# Altium project ADV212BBCZ-150.PrjPcb (part 1 of 2)
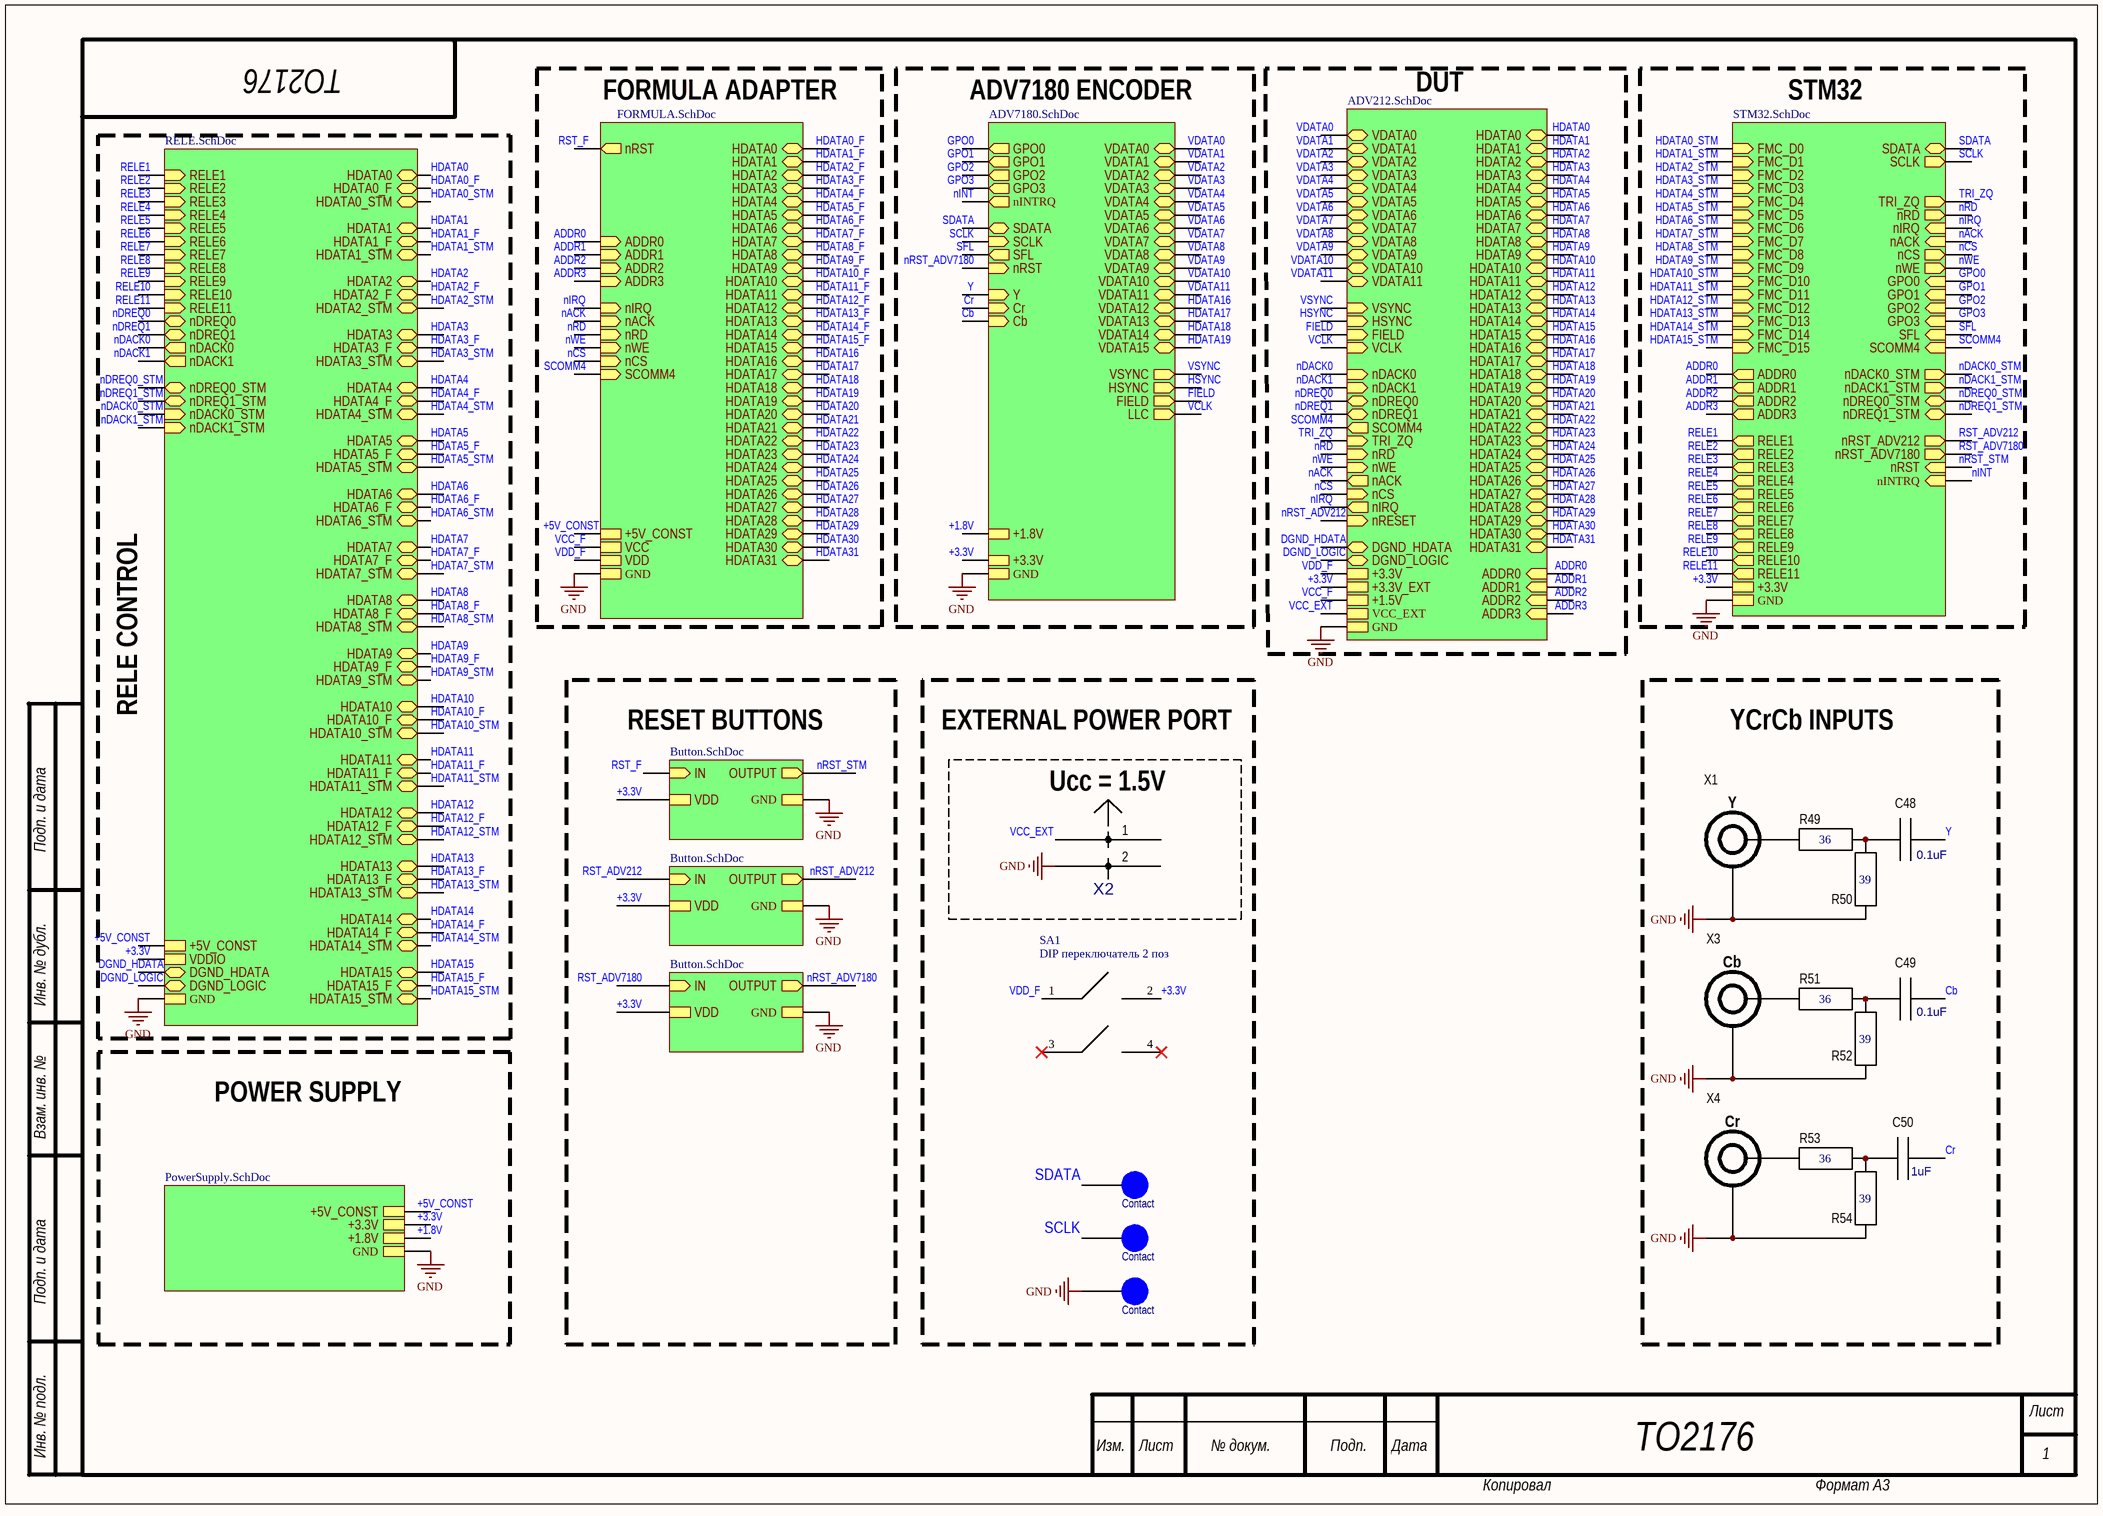
[diagram p0: Main.SchDoc]
8 sheets, 345 parts. Net scope: strictly hierarchical (ports join the sheet entries above them; power ports are local).
Board file: PCB1.PcbDoc
Sheets:
  Main.SchDoc
    ADV212 = ADV212.SchDoc
    STM32 = STM32.SchDoc
    F2K = FORMULA.SchDoc
    ADV7180 = ADV7180.SchDoc
    REL = RELE.SchDoc
    PS = PowerSupply.SchDoc
    BTN1 = Button.SchDoc
    BTN2 = Button.SchDoc
    BTN2 = Button.SchDoc

## Sheet Main.SchDoc
size A3; SheetNumber: 1; SheetTotal: 8

### Parts
C48  0.1uF  [0603]
C49  0.1uF  [0603]
C50  1uF  [0603]
KP1  Contact  [Contact]
KP2  Contact  [Contact]
KP3  Contact  [Contact]
R49  36  [0603]
R50  39  [0603]
R51  36  [0603]
R52  39  [0603]
R53  36  [0603]
R54  39  [0603]
SA1  DIP переключатель 2 поз  [DMHA-02G]
X1  Коннектор "Тюльпан"  [NYS-354]  (value not drawn)
X2  DS1073-01-2x1-MRT6 (2pin)  [DS1073-01-2x1-MRT6 (2 pin)]  (value not drawn)
X3  Коннектор "Тюльпан"  [NYS-354]  (value not drawn)
X4  Коннектор "Тюльпан"  [NYS-354]  (value not drawn)

### Blocks framed on the sheet
EXTERNAL POWER PORT: KP1-KP3 SA1
YCrCb INPUTS: C48-C50 R49-R54 X1 X3 X4
Ucc = 1.5V: X2

### Sub-sheets
ADV212 = ADV212.SchDoc: HDATA7 (bidir), HDATA8 (bidir), HDATA6 (bidir), HDATA5 (bidir), HDATA11 (bidir), HDATA10 (bidir), HDATA3 (bidir), HDATA4 (bidir), HDATA9 (bidir), HDATA12 (bidir), HDATA13 (bidir), HDATA14 (bidir), HDATA15 (bidir), HDATA2 (bidir), HDATA1 (bidir), HDATA0 (bidir), VDATA9 (bidir), VDATA10 (bidir), VDATA8 (bidir), VDATA7 (bidir), VDATA5 (bidir), VDATA6 (bidir), VDATA11 (bidir), VDATA4 (bidir), VDATA3 (bidir), VDATA2 (bidir), ADDR1 (in), ADDR2 (in), ADDR0 (in), ADDR3 (in), nRD (in), nWE (in), nACK (out), nCS (in), nIRQ (out), nDREQ1 (bidir), nDACK0 (in), nDACK1 (in), nDREQ0 (bidir), +3.3V_EXT, +1.5V, TRI_ZQ (in), FIELD (in), VSYNC (in), HSYNC (in), +3.3V, VCLK (in), nRESET (in), SCOMM4 (out), HDATA19 (bidir), HDATA18 (bidir), HDATA17 (bidir), HDATA16 (bidir), VDATA0 (bidir), VDATA1 (bidir), DGND_LOGIC (bidir), DGND_HDATA (bidir), HDATA27 (bidir), HDATA24 (bidir), HDATA28 (bidir), HDATA20 (bidir), HDATA26 (bidir), HDATA22 (bidir), HDATA31 (bidir), HDATA25 (bidir), HDATA29 (bidir), HDATA23 (bidir), HDATA21 (bidir), HDATA30 (bidir), GND, VCC_EXT
ADV7180 = ADV7180.SchDoc: +1.8V, GPO3 (out), VSYNC (out), VDATA5 (bidir), SDATA (bidir), SFL (out), VDATA0 (bidir), VDATA8 (bidir), VDATA13 (bidir), VDATA12 (bidir), GPO2 (out), +3.3V, VDATA4 (bidir), VDATA9 (bidir), VDATA2 (bidir), GPO1 (out), FIELD (out), LLC (out), VDATA10 (bidir), GPO0 (out), VDATA6 (bidir), SCLK (in), VDATA7 (bidir), HSYNC (out), VDATA3 (bidir), VDATA11 (bidir), VDATA14 (bidir), VDATA1 (bidir), VDATA15 (bidir), Cr (in), Cb (in), Y (in), nRST (in), GND, nINTRQ (out)
BTN1 = Button.SchDoc: VDD, IN (in), OUTPUT (out), GND
BTN2 = Button.SchDoc: VDD, IN (in), OUTPUT (out), GND
BTN2 = Button.SchDoc: VDD, IN (in), OUTPUT (out), GND
F2K = FORMULA.SchDoc: HDATA13 (bidir), HDATA12 (bidir), HDATA9 (bidir), HDATA6 (bidir), HDATA10 (bidir), HDATA4 (bidir), HDATA3 (bidir), HDATA8 (bidir), HDATA11 (bidir), HDATA2 (bidir), HDATA14 (bidir), HDATA15 (bidir), HDATA1 (bidir), HDATA7 (bidir), HDATA0 (bidir), HDATA5 (bidir), nRST (out), VDD, VCC, ADDR0 (in), ADDR3 (in), SCOMM4 (in), nCS (in), nIRQ (in), nACK (in), ADDR2 (in), ADDR1 (in), nRD (in), nWE (in), HDATA22 (bidir), HDATA29 (bidir), HDATA24 (bidir), HDATA28 (bidir), HDATA26 (bidir), HDATA16 (bidir), HDATA18 (bidir), HDATA21 (bidir), HDATA30 (bidir), HDATA31 (bidir), HDATA17 (bidir), HDATA23 (bidir), HDATA27 (bidir), HDATA19 (bidir), HDATA25 (bidir), HDATA20 (bidir), +5V_CONST, GND
PS = PowerSupply.SchDoc: +1.8V, +5V_CONST, +3.3V, GND
REL = RELE.SchDoc: RELE9 (in), RELE10 (in), RELE4 (in), RELE7 (in), RELE3 (in), RELE1 (in), RELE6 (in), RELE5 (in), RELE8 (in), RELE2 (in), +5V_CONST, VDDIO, HDATA15 (bidir), HDATA5 (bidir), HDATA5_STM (bidir), HDATA4 (bidir), nDACK0 (out), HDATA12 (bidir), HDATA2_STM (bidir), HDATA2 (bidir), HDATA8_STM (bidir), HDATA7 (bidir), nDACK1 (out), HDATA7_STM (bidir), HDATA8 (bidir), HDATA3 (bidir), HDATA4_STM (bidir), nDREQ0 (bidir), HDATA10 (bidir), HDATA0_STM (bidir), HDATA14 (bidir), HDATA1_STM (bidir), HDATA9 (bidir), HDATA11 (bidir), HDATA13 (bidir), HDATA0 (bidir), HDATA6_STM (bidir), nDREQ1 (bidir), HDATA9_STM (bidir), HDATA6 (bidir), HDATA3_STM (bidir), HDATA1 (bidir), HDATA14_F (bidir), HDATA14_STM (bidir), HDATA10_F (bidir), HDATA8_F (bidir), HDATA15_STM (bidir), HDATA9_F (bidir), HDATA3_F (bidir), nDREQ0_STM (bidir), HDATA7_F (bidir), HDATA11_F (bidir), HDATA4_F (bidir), HDATA6_F (bidir), HDATA10_STM (bidir), HDATA5_F (bidir), HDATA13_F (bidir), HDATA11_STM (bidir), nDACK1_STM (in), nDREQ1_STM (bidir), HDATA13_STM (bidir), HDATA15_F (bidir), HDATA2_F (bidir), HDATA1_F (bidir), HDATA12_F (bidir), HDATA0_F (bidir), HDATA12_STM (bidir), nDACK0_STM (in), RELE11 (in), DGND_HDATA (bidir), DGND_LOGIC (bidir), GND
STM32 = STM32.SchDoc: FMC_D9 (in), FMC_D13 (in), FMC_D11 (in), FMC_D2 (in), FMC_D15 (in), FMC_D1 (in), FMC_D0 (in), FMC_D7 (in), FMC_D8 (in), FMC_D5 (in), FMC_D12 (in), FMC_D4 (in), FMC_D6 (in), FMC_D3 (in), FMC_D10 (in), FMC_D14 (in), ADDR2 (out), ADDR0 (out), ADDR3 (out), ADDR1 (out), nDACK0_STM (out), nDREQ1_STM (bidir), nDACK1_STM (out), nDREQ0_STM (bidir), +3.3V, SDATA (bidir), SCLK (out), TRI_ZQ (out), nRD (out), nIRQ (in), nACK (in), nCS (out), nWE (out), GPO1 (in), GPO2 (in), GPO0 (in), SFL (in), GPO3 (in), nRST (in), RELE8 (out), RELE6 (out), RELE7 (out), RELE9 (out), RELE1 (out), RELE2 (out), RELE10 (out), RELE4 (out), RELE3 (out), RELE5 (out), RELE11 (out), nRST_ADV212 (out), nRST_ADV7180 (out), SCOMM4 (in), GND, nINTRQ (in)

### Nets
+1.8V: sheet ADV7180/+1.8V, sheet PS/+1.8V
+3.3V: SA1.2 ; sheet ADV212/+3.3V_EXT, sheet STM32/+3.3V, sheet ADV7180/+3.3V, sheet REL/VDDIO, sheet PS/+3.3V, sheet BTN1/VDD, sheet BTN2/VDD, sheet BTN2/VDD
GND: KP3.1 R50.1 R52.2 R54.2 X1.2 X2.2 X3.2 X4.2 ; sheet ADV212/GND, sheet STM32/GND, sheet F2K/GND, sheet ADV7180/GND, sheet REL/GND, sheet PS/GND, sheet BTN1/GND, sheet BTN2/GND, sheet BTN2/GND
VCC_EXT: X2.1 ; sheet ADV212/VCC_EXT
VCC_F: sheet ADV212/+1.5V, sheet F2K/VCC  [project net +1.5V]
VDD_F: SA1.1 ; sheet ADV212/+3.3V, sheet F2K/VDD  [project net +3.3V]
+5V_CONST: sheet F2K/+5V_CONST, sheet REL/+5V_CONST, sheet PS/+5V_CONST  [project net +5V]
ADDR0: sheet ADV212/ADDR0, sheet STM32/ADDR0, sheet F2K/ADDR0
ADDR1: sheet ADV212/ADDR1, sheet STM32/ADDR1, sheet F2K/ADDR1
ADDR2: sheet ADV212/ADDR2, sheet STM32/ADDR2, sheet F2K/ADDR2
ADDR3: sheet ADV212/ADDR3, sheet STM32/ADDR3, sheet F2K/ADDR3
Cb: C49.1 ; sheet ADV7180/Cb
Cr: C50.1 ; sheet ADV7180/Cr
DGND_HDATA: sheet ADV212/DGND_HDATA, sheet REL/DGND_HDATA  [project net DGND_1]
DGND_LOGIC: sheet ADV212/DGND_LOGIC, sheet REL/DGND_LOGIC  [project net DGND_2]
FIELD: sheet ADV212/FIELD, sheet ADV7180/FIELD
GPO0: sheet STM32/GPO0, sheet ADV7180/GPO0
GPO1: sheet STM32/GPO1, sheet ADV7180/GPO1
GPO2: sheet STM32/GPO2, sheet ADV7180/GPO2
GPO3: sheet STM32/GPO3, sheet ADV7180/GPO3
HDATA0: sheet ADV212/HDATA0, sheet REL/HDATA0
HDATA0_F: sheet F2K/HDATA0, sheet REL/HDATA0_F
HDATA0_STM: sheet STM32/FMC_D0, sheet REL/HDATA0_STM  [project net FMC_D0]
HDATA1: sheet ADV212/HDATA1, sheet REL/HDATA1
HDATA1_F: sheet F2K/HDATA1, sheet REL/HDATA1_F
HDATA1_STM: sheet STM32/FMC_D1, sheet REL/HDATA1_STM  [project net FMC_D1]
HDATA2: sheet ADV212/HDATA2, sheet REL/HDATA2
HDATA2_F: sheet F2K/HDATA2, sheet REL/HDATA2_F
HDATA2_STM: sheet STM32/FMC_D2, sheet REL/HDATA2_STM  [project net FMC_D2]
HDATA3: sheet ADV212/HDATA3, sheet REL/HDATA3
HDATA3_F: sheet F2K/HDATA3, sheet REL/HDATA3_F
HDATA3_STM: sheet STM32/FMC_D3, sheet REL/HDATA3_STM  [project net FMC_D3]
HDATA4: sheet ADV212/HDATA4, sheet REL/HDATA4
HDATA4_F: sheet F2K/HDATA4, sheet REL/HDATA4_F
HDATA4_STM: sheet STM32/FMC_D4, sheet REL/HDATA4_STM  [project net FMC_D4]
HDATA5: sheet ADV212/HDATA5, sheet REL/HDATA5
HDATA5_F: sheet F2K/HDATA5, sheet REL/HDATA5_F
HDATA5_STM: sheet STM32/FMC_D5, sheet REL/HDATA5_STM  [project net FMC_D5]
HDATA6: sheet ADV212/HDATA6, sheet REL/HDATA6
HDATA6_F: sheet F2K/HDATA6, sheet REL/HDATA6_F
HDATA6_STM: sheet STM32/FMC_D6, sheet REL/HDATA6_STM  [project net FMC_D6]
HDATA7: sheet ADV212/HDATA7, sheet REL/HDATA7
HDATA7_F: sheet F2K/HDATA7, sheet REL/HDATA7_F
HDATA7_STM: sheet STM32/FMC_D7, sheet REL/HDATA7_STM  [project net FMC_D7]
HDATA8: sheet ADV212/HDATA8, sheet REL/HDATA8
HDATA8_F: sheet F2K/HDATA8, sheet REL/HDATA8_F
HDATA8_STM: sheet STM32/FMC_D8, sheet REL/HDATA8_STM  [project net FMC_D8]
HDATA9: sheet ADV212/HDATA9, sheet REL/HDATA9
HDATA9_F: sheet F2K/HDATA9, sheet REL/HDATA9_F
HDATA9_STM: sheet STM32/FMC_D9, sheet REL/HDATA9_STM  [project net FMC_D9]
HDATA10: sheet ADV212/HDATA10, sheet REL/HDATA10
HDATA10_F: sheet F2K/HDATA10, sheet REL/HDATA10_F
HDATA10_STM: sheet STM32/FMC_D10, sheet REL/HDATA10_STM  [project net FMC_D10]
HDATA11: sheet ADV212/HDATA11, sheet REL/HDATA11
HDATA11_F: sheet F2K/HDATA11, sheet REL/HDATA11_F
HDATA11_STM: sheet STM32/FMC_D11, sheet REL/HDATA11_STM  [project net FMC_D11]
HDATA12: sheet ADV212/HDATA12, sheet REL/HDATA12
HDATA12_F: sheet F2K/HDATA12, sheet REL/HDATA12_F
HDATA12_STM: sheet STM32/FMC_D12, sheet REL/HDATA12_STM  [project net FMC_D12]
HDATA13: sheet ADV212/HDATA13, sheet REL/HDATA13
HDATA13_F: sheet F2K/HDATA13, sheet REL/HDATA13_F
HDATA13_STM: sheet STM32/FMC_D13, sheet REL/HDATA13_STM  [project net FMC_D13]
HDATA14: sheet ADV212/HDATA14, sheet REL/HDATA14
HDATA14_F: sheet F2K/HDATA14, sheet REL/HDATA14_F
HDATA14_STM: sheet STM32/FMC_D14, sheet REL/HDATA14_STM  [project net FMC_D14]
HDATA15: sheet ADV212/HDATA15, sheet REL/HDATA15
HDATA15_F: sheet F2K/HDATA15, sheet REL/HDATA15_F
HDATA15_STM: sheet STM32/FMC_D15, sheet REL/HDATA15_STM  [project net FMC_D15]
HDATA16: sheet ADV212/HDATA16, sheet F2K/HDATA16, sheet ADV7180/VDATA12
HDATA17: sheet ADV212/HDATA17, sheet F2K/HDATA17, sheet ADV7180/VDATA13
HDATA18: sheet ADV212/HDATA18, sheet F2K/HDATA18, sheet ADV7180/VDATA14
HDATA19: sheet ADV212/HDATA19, sheet F2K/HDATA19, sheet ADV7180/VDATA15
HDATA20: sheet ADV212/HDATA20, sheet F2K/HDATA20
HDATA21: sheet ADV212/HDATA21, sheet F2K/HDATA21
HDATA22: sheet ADV212/HDATA22, sheet F2K/HDATA22
HDATA23: sheet ADV212/HDATA23, sheet F2K/HDATA23
HDATA24: sheet ADV212/HDATA24, sheet F2K/HDATA24
HDATA25: sheet ADV212/HDATA25, sheet F2K/HDATA25
HDATA26: sheet ADV212/HDATA26, sheet F2K/HDATA26
HDATA27: sheet ADV212/HDATA27, sheet F2K/HDATA27
HDATA28: sheet ADV212/HDATA28, sheet F2K/HDATA28
HDATA29: sheet ADV212/HDATA29, sheet F2K/HDATA29
HDATA30: sheet ADV212/HDATA30, sheet F2K/HDATA30
HDATA31: sheet ADV212/HDATA31, sheet F2K/HDATA31
HSYNC: sheet ADV212/HSYNC, sheet ADV7180/HSYNC
nACK: sheet ADV212/nACK, sheet STM32/nACK, sheet F2K/nACK
nCS: sheet ADV212/nCS, sheet STM32/nCS, sheet F2K/nCS
nDACK0: sheet ADV212/nDACK0, sheet REL/nDACK0
nDACK0_STM: sheet STM32/nDACK0_STM, sheet REL/nDACK0_STM
nDACK1: sheet ADV212/nDACK1, sheet REL/nDACK1
nDACK1_STM: sheet STM32/nDACK1_STM, sheet REL/nDACK1_STM
nDREQ0: sheet ADV212/nDREQ0, sheet REL/nDREQ0
nDREQ0_STM: sheet STM32/nDREQ0_STM, sheet REL/nDREQ0_STM
nDREQ1: sheet ADV212/nDREQ1, sheet REL/nDREQ1
nDREQ1_STM: sheet STM32/nDREQ1_STM, sheet REL/nDREQ1_STM
nINT: sheet STM32/nINTRQ, sheet ADV7180/nINTRQ  [project net INTRQ]
nIRQ: sheet ADV212/nIRQ, sheet STM32/nIRQ, sheet F2K/nIRQ
nRD: sheet ADV212/nRD, sheet STM32/nRD, sheet F2K/nRD
nRST_ADV212: sheet ADV212/nRESET, sheet BTN2/OUTPUT  [project net nRESET]
nRST_ADV7180: sheet ADV7180/nRST, sheet BTN2/OUTPUT
nRST_STM: sheet STM32/nRST, sheet BTN1/OUTPUT  [project net nRESET_STM]
nWE: sheet ADV212/nWE, sheet STM32/nWE, sheet F2K/nWE
RELE1: sheet STM32/RELE1, sheet REL/RELE1
RELE2: sheet STM32/RELE2, sheet REL/RELE2
RELE3: sheet STM32/RELE3, sheet REL/RELE3
RELE4: sheet STM32/RELE4, sheet REL/RELE4
RELE5: sheet STM32/RELE5, sheet REL/RELE5
RELE6: sheet STM32/RELE6, sheet REL/RELE6
RELE7: sheet STM32/RELE7, sheet REL/RELE7
RELE8: sheet STM32/RELE8, sheet REL/RELE8
RELE9: sheet STM32/RELE9, sheet REL/RELE9
RELE10: sheet STM32/RELE10, sheet REL/RELE10
RELE11: sheet STM32/RELE11, sheet REL/RELE11
RST_ADV212: sheet STM32/nRST_ADV212, sheet BTN2/IN  [project net nRS_ADV212]
RST_ADV7180: sheet STM32/nRST_ADV7180, sheet BTN2/IN  [project net nRS_ADV718]
RST_F: sheet F2K/nRST, sheet BTN1/IN
SCLK: KP2.1 ; sheet STM32/SCLK, sheet ADV7180/SCLK
SCOMM4: sheet ADV212/SCOMM4, sheet STM32/SCOMM4, sheet F2K/SCOMM4
SDATA: KP1.1 ; sheet STM32/SDATA, sheet ADV7180/SDATA
SFL: sheet STM32/SFL, sheet ADV7180/SFL
TRI_ZQ: sheet ADV212/TRI_ZQ, sheet STM32/TRI_ZQ
VCLK: sheet ADV212/VCLK, sheet ADV7180/LLC
VDATA0: sheet ADV212/VDATA0, sheet ADV7180/VDATA0
VDATA1: sheet ADV212/VDATA1, sheet ADV7180/VDATA1
VDATA2: sheet ADV212/VDATA2, sheet ADV7180/VDATA2
VDATA3: sheet ADV212/VDATA3, sheet ADV7180/VDATA3
VDATA4: sheet ADV212/VDATA4, sheet ADV7180/VDATA4
VDATA5: sheet ADV212/VDATA5, sheet ADV7180/VDATA5
VDATA6: sheet ADV212/VDATA6, sheet ADV7180/VDATA6
VDATA7: sheet ADV212/VDATA7, sheet ADV7180/VDATA7
VDATA8: sheet ADV212/VDATA8, sheet ADV7180/VDATA8
VDATA9: sheet ADV212/VDATA9, sheet ADV7180/VDATA9
VDATA10: sheet ADV212/VDATA10, sheet ADV7180/VDATA10
VDATA11: sheet ADV212/VDATA11, sheet ADV7180/VDATA11
VSYNC: sheet ADV212/VSYNC, sheet ADV7180/VSYNC
Y: C48.1 ; sheet ADV7180/Y
NetC48_2: C48.2 R49.2 R50.2
NetC49_2: C49.2 R51.2 R52.1
NetC50_2: C50.2 R53.2 R54.1
NetR49_1: R49.1 X1.1
NetR51_1: R51.1 X3.1
NetR53_1: R53.1 X4.1

Not connected (* = marked no-connect by the designer): SA1 3* 4*

### Notes on the sheet
- ТО2176
- FORMULA ADAPTER
- ADV7180 ENCODER
- DUT
- STM32
- RELE CONTROL
- RESET BUTTONS
- Подп. и дата
- (near X1) Y
- (near X3) Cb
- Инв. № дубл.
- POWER SUPPLY
- (near X4) Cr
- Взам. инв. №
- Инв. № подл.
- Изм.
- Лист
- № докум.
- Подп.
- Дата
- 1
- Копировал
- Формат А3
- (in symbol OpAmpType3) OUT; V+; V-; DOP; +IN; -IN; EP

### Library data of the parts
C48-C50 = C0603: ComponentHeigt: 1.3; Firme: AVX; Leadform: SMD; KIND: Конденсатор; ClassName: *; Component Link: *; ComponentWeigt: *; Packaging: 0805; NN: *; Value: *
R49-R54 = R0603 Yageo: ComponentHeigt: 0.5; Leadform: SMD; Firme: Yageo; Kind: Резистор; Packaging: 0402; ClassName: *; Component Link: *; NN: *
SA1 = DMHA-02G-G
X1 = NYS-354: Y
X2 = DS1073-01-2x1-MRT6 (2pin): ComponentHeigt: 5.5; Name: Вилка; Specification: Вилка PLD2-2 *; Typ: PLD2-2; ClassName: *; Component Link: *; ComponentWeigt: *; Firme: *; Leadform: *; NN: *; KIND: *
X3 = NYS-354: Cb
X4 = NYS-354: Cr

## Sheet ADV212.SchDoc
size A2; SheetNumber: 2; SheetTotal: 8
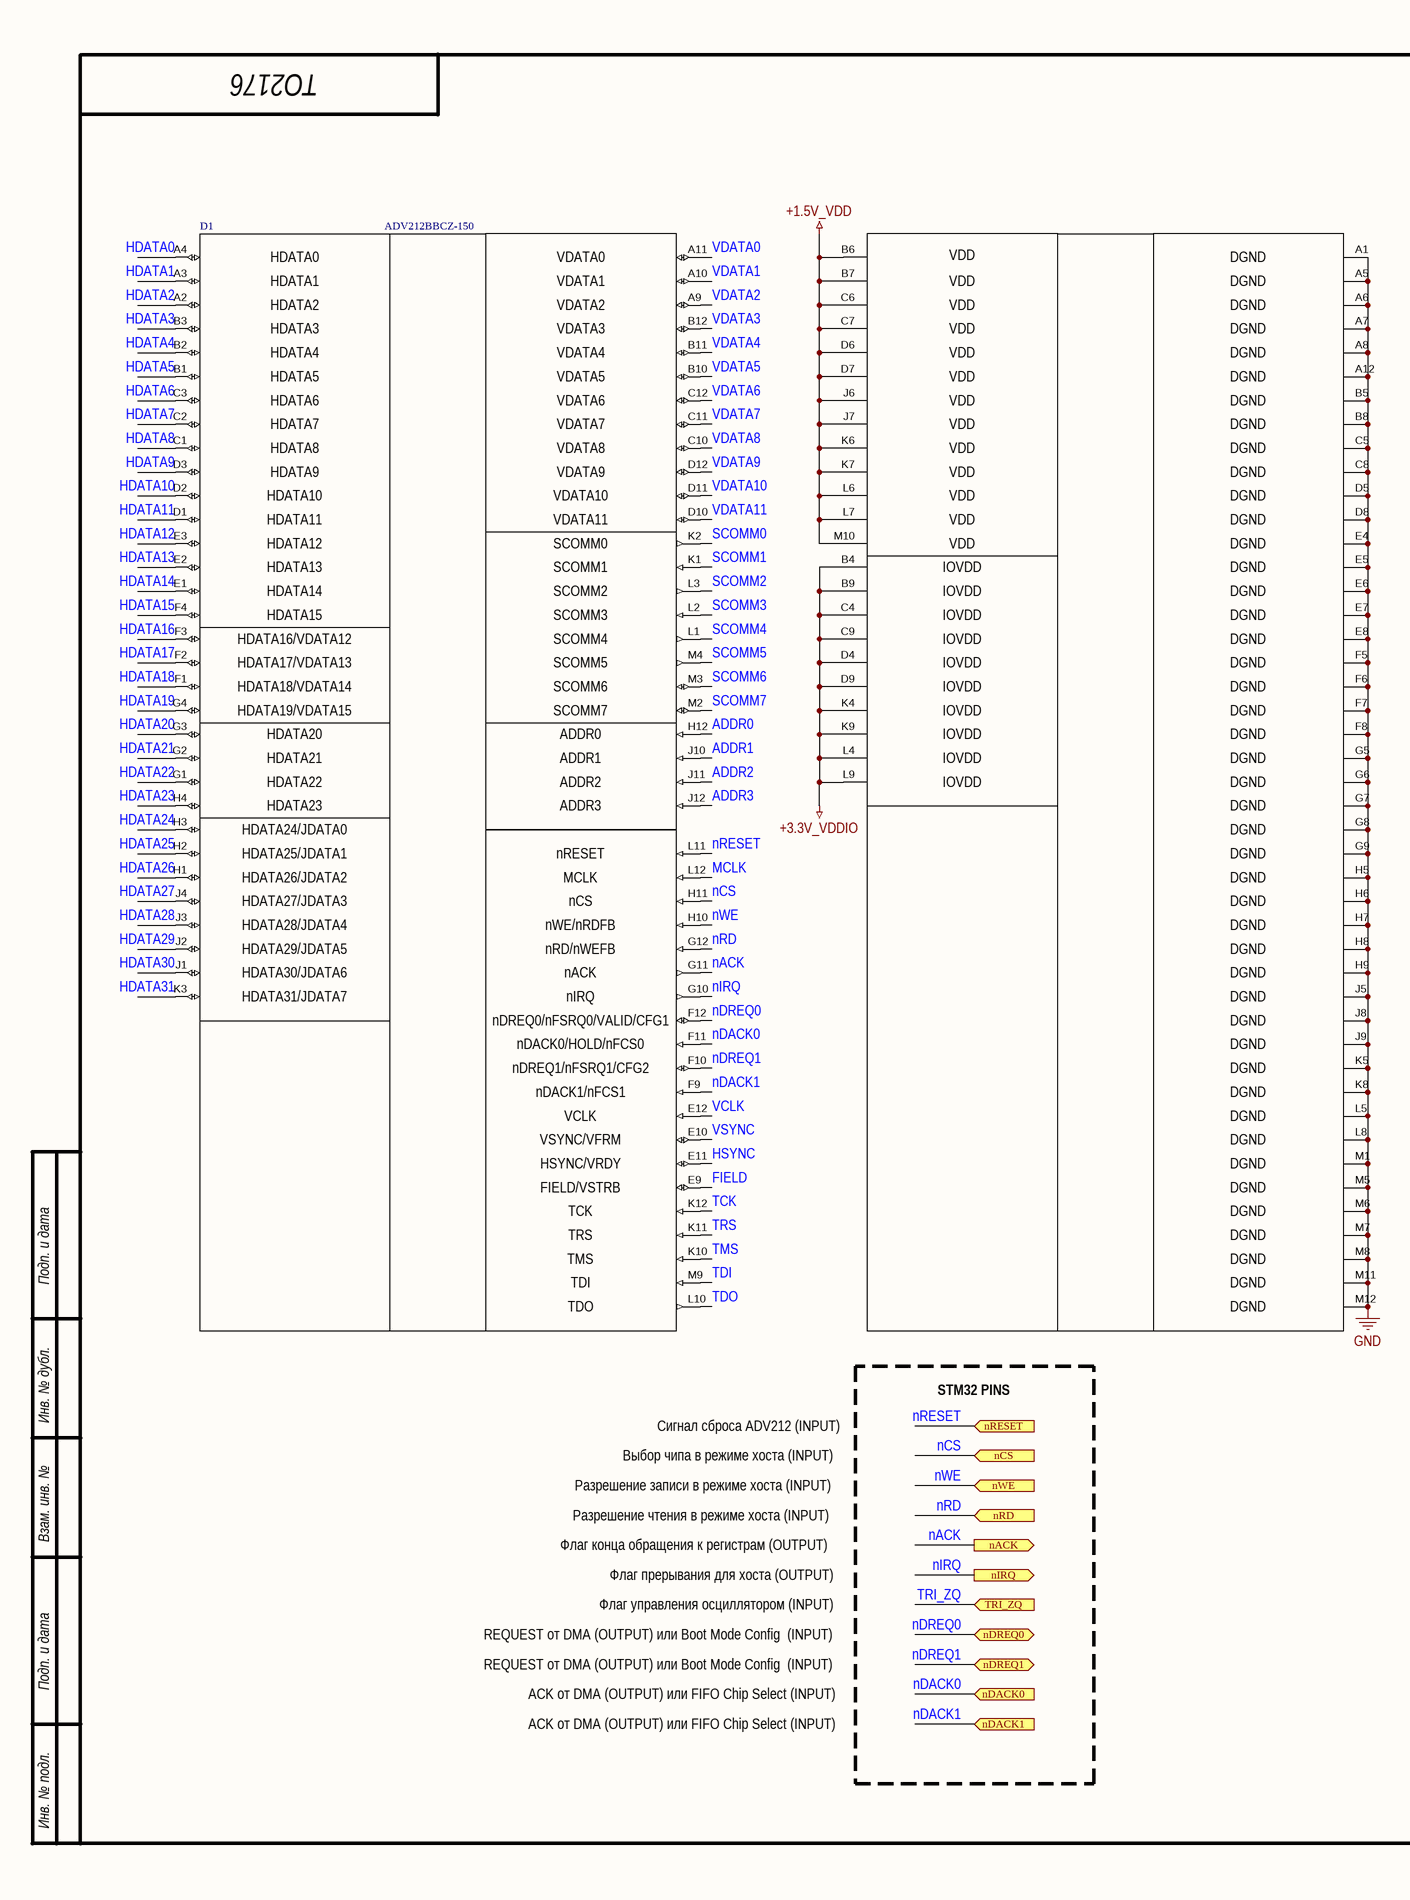
[diagram p1: ADV212.SchDoc, left]
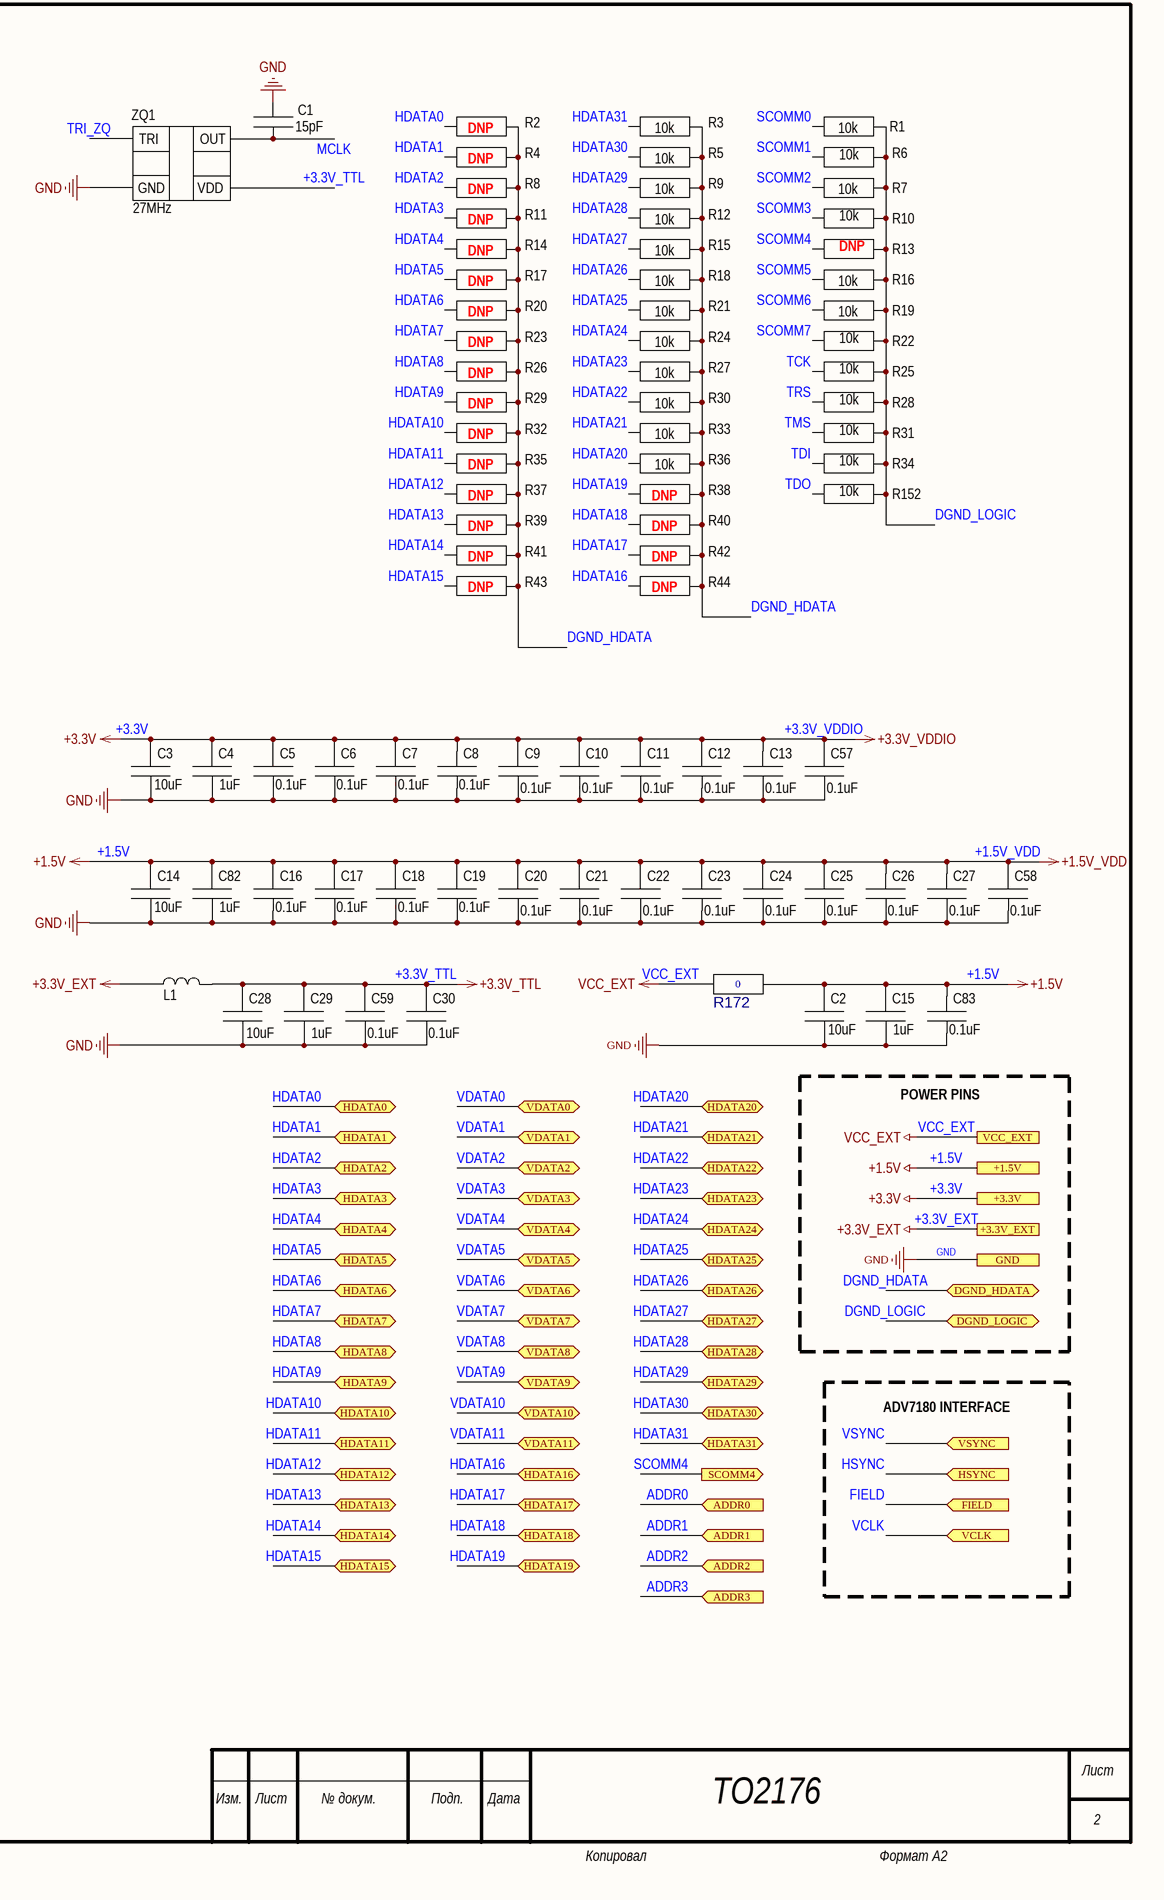
[diagram p2: ADV212.SchDoc, right]

### Parts
C1  15pF  [0603]
C2  10uF  [0603]
C3  10uF  [0603]
C4  1uF  [0603]
C5  0.1uF  [0603]
C6  0.1uF  [0603]
C7  0.1uF  [0603]
C8  0.1uF  [0603]
C9  0.1uF  [0603]
C10  0.1uF  [0603]
C11  0.1uF  [0603]
C12  0.1uF  [0603]
C13  0.1uF  [0603]
C14  10uF  [0603]
C15  1uF  [0603]
C16  0.1uF  [0603]
C17  0.1uF  [0603]
C18  0.1uF  [0603]
C19  0.1uF  [0603]
C20  0.1uF  [0603]
C21  0.1uF  [0603]
C22  0.1uF  [0603]
C23  0.1uF  [0603]
C24  0.1uF  [0603]
C25  0.1uF  [0603]
C26  0.1uF  [0603]
C27  0.1uF  [0603]
C28  10uF  [0603]
C29  1uF  [0603]
C30  0.1uF  [0603]
C57  0.1uF  [0603]
C58  0.1uF  [0603]
C59  0.1uF  [0603]
C82  1uF  [0603]
C83  0.1uF  [0603]
D1  ADV212BBCZ-150  [BGA-144 12x12]
L1  BLM18AG221SN1D (0603)  [0805]  (value not drawn)
R1  10k  [0603]
R2  DNP  [0603]
R3  10k  [0603]
R4  DNP  [0603]
R5  10k  [0603]
R6  10k  [0603]
R7  10k  [0603]
R8  DNP  [0603]
R9  10k  [0603]
R10  10k  [0603]
R11  DNP  [0603]
R12  10k  [0603]
R13  DNP  [0603]
R14  DNP  [0603]
R15  10k  [0603]
R16  10k  [0603]
R17  DNP  [0603]
R18  10k  [0603]
R19  10k  [0603]
R20  DNP  [0603]
R21  10k  [0603]
R22  10k  [0603]
R23  DNP  [0603]
R24  10k  [0603]
R25  10k  [0603]
R26  DNP  [0603]
R27  10k  [0603]
R28  10k  [0603]
R29  DNP  [0603]
R30  10k  [0603]
R31  10k  [0603]
R32  DNP  [0603]
R33  10k  [0603]
R34  10k  [0603]
R35  DNP  [0603]
R36  10k  [0603]
R37  DNP  [0603]
R38  DNP  [0603]
R39  DNP  [0603]
R40  DNP  [0603]
R41  DNP  [0603]
R42  DNP  [0603]
R43  DNP  [0603]
R44  DNP  [0603]
R152  10k  [0603]
R172  0  [0603]
ZQ1  27MHz  [SOC3 SMD]

### Ports
+1.5V, +3.3V, +3.3V_EXT, ADDR0 (in), ADDR1 (in), ADDR2 (in), ADDR3 (in), DGND_HDATA (bidir), DGND_LOGIC (bidir), FIELD (in), GND, HDATA0 (bidir), HDATA1 (bidir), HDATA2 (bidir), HDATA3 (bidir), HDATA4 (bidir), HDATA5 (bidir), HDATA6 (bidir), HDATA7 (bidir), HDATA8 (bidir), HDATA9 (bidir), HDATA10 (bidir), HDATA11 (bidir), HDATA12 (bidir), HDATA13 (bidir), HDATA14 (bidir), HDATA15 (bidir), HDATA16 (bidir), HDATA17 (bidir), HDATA18 (bidir), HDATA19 (bidir), HDATA20 (bidir), HDATA21 (bidir), HDATA22 (bidir), HDATA23 (bidir), HDATA24 (bidir), HDATA25 (bidir), HDATA26 (bidir), HDATA27 (bidir), HDATA28 (bidir), HDATA29 (bidir), HDATA30 (bidir), HDATA31 (bidir), HSYNC (in), nACK (out), nCS (in), nDACK0 (in), nDACK1 (in), nDREQ0 (bidir), nDREQ1 (bidir), nIRQ (out), nRD (in), nRESET (in), nWE (in), SCOMM4 (out), TRI_ZQ (in), VCC_EXT, VCLK (in), VDATA0 (bidir), VDATA1 (bidir), VDATA2 (bidir), VDATA3 (bidir), VDATA4 (bidir), VDATA5 (bidir), VDATA6 (bidir), VDATA7 (bidir), VDATA8 (bidir), VDATA9 (bidir), VDATA10 (bidir), VDATA11 (bidir), VSYNC (in)

### Nets
+1.5V: C2.1 C14.1 C15.1 C16.1 C17.1 C18.1 C19.1 C20.1 C21.1 C22.1 C23.1 C24.1 C25.1 C26.1 C27.1 C58.1 C82.1 C83.1 D1.B6 D1.B7 D1.C6 D1.C7 D1.D6 D1.D7 D1.J6 D1.J7 D1.K6 D1.K7 D1.L6 D1.L7 D1.M10 R172.2 ; port +1.5V  [also labelled +1.5V_VDD]
+3.3V: C3.1 C4.1 C5.1 C6.1 C7.1 C8.1 C9.1 C10.1 C11.1 C12.1 C13.1 C57.1 D1.B4 D1.B9 D1.C4 D1.C9 D1.D4 D1.D9 D1.K4 D1.K9 D1.L4 D1.L9 ; port +3.3V  [also labelled +3.3V_VDDIO]
+3.3V_EXT: L1.1 ; port +3.3V_EXT  [project net +3.3V]
+3.3V_TTL: C28.1 C29.1 C30.1 C59.1 L1.2 ZQ1.4
GND: C1.1 C2.2 C3.2 C4.2 C5.2 C6.2 C7.2 C8.2 C9.2 C10.2 C11.2 C12.2 C13.2 C14.2 C15.2 C16.2 C17.2 C18.2 C19.2 C20.2 C21.2 C22.2 C23.2 C24.2 C25.2 C26.2 C27.2 C28.2 C29.2 C30.2 C57.2 C58.2 C59.2 C82.2 C83.2 D1.A1 D1.A5 D1.A6 D1.A7 D1.A8 D1.A12 D1.B5 D1.B8 D1.C5 D1.C8 D1.D5 D1.D8 D1.E4 D1.E5 D1.E6 D1.E7 D1.E8 D1.F5 D1.F6 D1.F7 D1.F8 D1.G5 D1.G6 D1.G7 D1.G8 D1.G9 D1.H5 D1.H6 D1.H7 D1.H8 D1.H9 D1.J5 D1.J8 D1.J9 D1.K5 D1.K8 D1.L5 D1.L8 D1.M1 D1.M5 D1.M6 D1.M7 D1.M8 D1.M11 D1.M12 ZQ1.2 ; port GND
VCC_EXT: R172.1 ; port VCC_EXT
ADDR0: D1.H12 ; port ADDR0
ADDR1: D1.J10 ; port ADDR1
ADDR2: D1.J11 ; port ADDR2
ADDR3: D1.J12 ; port ADDR3
DGND_HDATA: R2.1 R3.1 R4.1 R5.1 R8.1 R9.1 R11.1 R12.1 R14.1 R15.1 R17.1 R18.1 R20.1 R21.1 R23.1 R24.1 R26.1 R27.1 R29.1 R30.1 R32.1 R33.1 R35.1 R36.1 R37.1 R38.1 R39.1 R40.1 R41.1 R42.1 R43.1 R44.1 ; port DGND_HDATA  [project net DGND_1]
DGND_LOGIC: R1.1 R6.1 R7.1 R10.1 R13.1 R16.1 R19.1 R22.1 R25.1 R28.1 R31.1 R34.1 R152.1 ; port DGND_LOGIC  [project net DGND_2]
FIELD: D1.E9 ; port FIELD
HDATA0: D1.A4 R2.2 ; port HDATA0
HDATA1: D1.A3 R4.2 ; port HDATA1
HDATA2: D1.A2 R8.2 ; port HDATA2
HDATA3: D1.B3 R11.2 ; port HDATA3
HDATA4: D1.B2 R14.2 ; port HDATA4
HDATA5: D1.B1 R17.2 ; port HDATA5
HDATA6: D1.C3 R20.2 ; port HDATA6
HDATA7: D1.C2 R23.2 ; port HDATA7
HDATA8: D1.C1 R26.2 ; port HDATA8
HDATA9: D1.D3 R29.2 ; port HDATA9
HDATA10: D1.D2 R32.2 ; port HDATA10
HDATA11: D1.D1 R35.2 ; port HDATA11
HDATA12: D1.E3(E) R37.2 ; port HDATA12
HDATA13: D1.E2(E) R39.2 ; port HDATA13
HDATA14: D1.E1 R41.2 ; port HDATA14
HDATA15: D1.F4 R43.2 ; port HDATA15
HDATA16: D1.F3 R44.2 ; port HDATA16
HDATA17: D1.F2 R42.2 ; port HDATA17
HDATA18: D1.F1 R40.2 ; port HDATA18
HDATA19: D1.G4 R38.2 ; port HDATA19
HDATA20: D1.G3 R36.2 ; port HDATA20
HDATA21: D1.G2 R33.2 ; port HDATA21
HDATA22: D1.G1 R30.2 ; port HDATA22
HDATA23: D1.H4 R27.2 ; port HDATA23
HDATA24: D1.H3 R24.2 ; port HDATA24
HDATA25: D1.H2 R21.2 ; port HDATA25
HDATA26: D1.H1 R18.2 ; port HDATA26
HDATA27: D1.J4 R15.2 ; port HDATA27
HDATA28: D1.J3 R12.2 ; port HDATA28
HDATA29: D1.J2 R9.2 ; port HDATA29
HDATA30: D1.J1 R5.2 ; port HDATA30
HDATA31: D1.K3 R3.2 ; port HDATA31
HSYNC: D1.E11 ; port HSYNC
MCLK: C1.2 D1.L12 ZQ1.3  [project net MCLK_2]
nACK: D1.G11 ; port nACK
nCS: D1.H11 ; port nCS
nDACK0: D1.F11 ; port nDACK0
nDACK1: D1.F9 ; port nDACK1
nDREQ0: D1.F12 ; port nDREQ0
nDREQ1: D1.F10 ; port nDREQ1
nIRQ: D1.G10 ; port nIRQ
nRD: D1.G12 ; port nRD
nRESET: D1.L11 ; port nRESET
nWE: D1.H10 ; port nWE
SCOMM0: D1.K2 R1.2  [project net SCOMM0_2]
SCOMM1: D1.K1 R6.2  [project net SCOMM1_2]
SCOMM2: D1.L3 R7.2  [project net SCOMM2_2]
SCOMM3: D1.L2 R10.2  [project net SCOMM3_2]
SCOMM4: D1.L1 R13.2 ; port SCOMM4
SCOMM5: D1.M4 R16.2  [project net SCOMM5_2]
SCOMM6: D1.M3 R19.2  [project net SCOMM6_2]
SCOMM7: D1.M2 R22.2  [project net SCOMM7_2]
TCK: D1.K12 R25.2  [project net TCK_2]
TDI: D1.M9 R34.2  [project net TDI_2]
TDO: D1.L10 R152.2  [project net TDO_2]
TMS: D1.K10 R31.2  [project net TMS_2]
TRI_ZQ: ZQ1.1 ; port TRI_ZQ
TRS: D1.K11 R28.2  [project net TRS_2]
VCLK: D1.E12 ; port VCLK
VDATA0: D1.A11 ; port VDATA0
VDATA1: D1.A10 ; port VDATA1
VDATA2: D1.A9 ; port VDATA2
VDATA3: D1.B12 ; port VDATA3
VDATA4: D1.B11 ; port VDATA4
VDATA5: D1.B10 ; port VDATA5
VDATA6: D1.C12 ; port VDATA6
VDATA7: D1.C11 ; port VDATA7
VDATA8: D1.C10 ; port VDATA8
VDATA9: D1.D12 ; port VDATA9
VDATA10: D1.D11 ; port VDATA10
VDATA11: D1.D10 ; port VDATA11
VSYNC: D1.E10 ; port VSYNC

### Notes on the sheet
- ТО2176
- POWER PINS
- Подп. и дата
- Инв. № дубл.
- Сигнал сброса ADV212 (INPUT)
- STM32 PINS
- ADV7180 INTERFACE
- Разрешение записи в режиме хоста (INPUT)
- Выбор чипа в режиме хоста (INPUT)
- Взам. инв. №
- Флаг конца обращения к регистрам (OUTPUT)
- Разрешение чтения в режиме хоста (INPUT)
- Флаг управления осциллятором (INPUT)
- Флаг прерывания для хоста (OUTPUT)
- REQUEST от DMA (OUTPUT) или Boot Mode Config  (INPUT)
- ACK от DMA (OUTPUT) или FIFO Chip Select (INPUT)
- Изм.
- Лист
- № докум.
- Подп.
- Дата
- Инв. № подл.
- Копировал
- Формат А2
- 2
- DWG NO:
- REV:
- THIS DOCUMENT AND THE DATA DISCLOSED HEREIN OR
- HEREWITH IS THE PROPERTY OF ALTIUM LIMITED AND MAY
- BE FREELY DISTRIBUTED IN WHOLE. NO RIGHTS ARE
- RESERVED OR EXPRESS OR IMPLIED WARANTEE GIVEN.
- REVISION
- DESCRIPTION
- DATE
- APPROVED
- ENG:
- APPROVALS
- PROJECT
- DSN:
- CHK:
- REFERENCE DOCUMENTS
- PROJECT REVISION:
- TITLE
- DOCUMENT REVISION:
- DESIGN ITEM:
- BOM:
- FAB DWG:
- PCB DWG:
- ASSY DWG:
- SCALE:
- A2
- SIZE
- CAGE CODE
- FILE NAME
- DWG NO.
- SHEET
- OF
- REV
- (in symbol ADV212BBCZ-150) HDATA0; VDATA0; VDD; DGND; HDATA1; VDATA1; HDATA2; VDATA2; HDATA3; VDATA3; HDATA4; VDATA4; HDATA5; VDATA5; HDATA6; VDATA6; HDATA7; VDATA7; HDATA8; VDATA8; HDATA9; VDATA9; HDATA10; VDATA10; HDATA11; VDATA11; HDATA12; SCOMM0; HDATA13; SCOMM1; IOVDD; HDATA14; SCOMM2; HDATA15; SCOMM3; HDATA16/VDATA12; SCOMM4; HDATA17/VDATA13; SCOMM5; HDATA18/VDATA14; SCOMM6; HDATA19/VDATA15; SCOMM7; HDATA20; ADDR0; HDATA21; ADDR1; HDATA22; ADDR2; HDATA23; ADDR3; HDATA24/JDATA0; HDATA25/JDATA1; nRESET; HDATA26/JDATA2; MCLK; HDATA27/JDATA3; nCS; HDATA28/JDATA4; nWE/nRDFB; HDATA29/JDATA5; nRD/nWEFB; HDATA30/JDATA6; nACK; HDATA31/JDATA7; nIRQ; nDREQ0/nFSRQ0/VALID/CFG1; nDACK0/HOLD/nFCS0; nDREQ1/nFSRQ1/CFG2; nDACK1/nFCS1; VCLK; VSYNC/VFRM; HSYNC/VRDY; FIELD/VSTRB; TCK; TRS; TMS; TDI; TDO
- (in symbol SOC3 SMD OSC) TRI; OUT; GND; VDD

### Library data of the parts
C1-C30 C57-C59 C82 C83 = C0603: as C48 on sheet Main; ClassName: *; Component Link: *; ComponentWeigt: *; Packaging: 0805; NN: *; Value: *
L1 = BLM21(0805) Murata: ComponentHeigt: 1.1; Leadform: SMD; Firme: Murata; ClassName: *; Component Link: *; ComponentWeigt: *; Packaging: 1206; NN: *; KIND: *
R1-R44 R152 R172 = R0603 Yageo: as R49 on sheet Main; Packaging: 0402; ClassName: *; Component Link: *; NN: *
ZQ1 = SOC3 SMD OSC: TTL CMOS 3.3V 27 MHz

## Sheet STM32.SchDoc
size A3; SheetNumber: 3; SheetTotal: 8
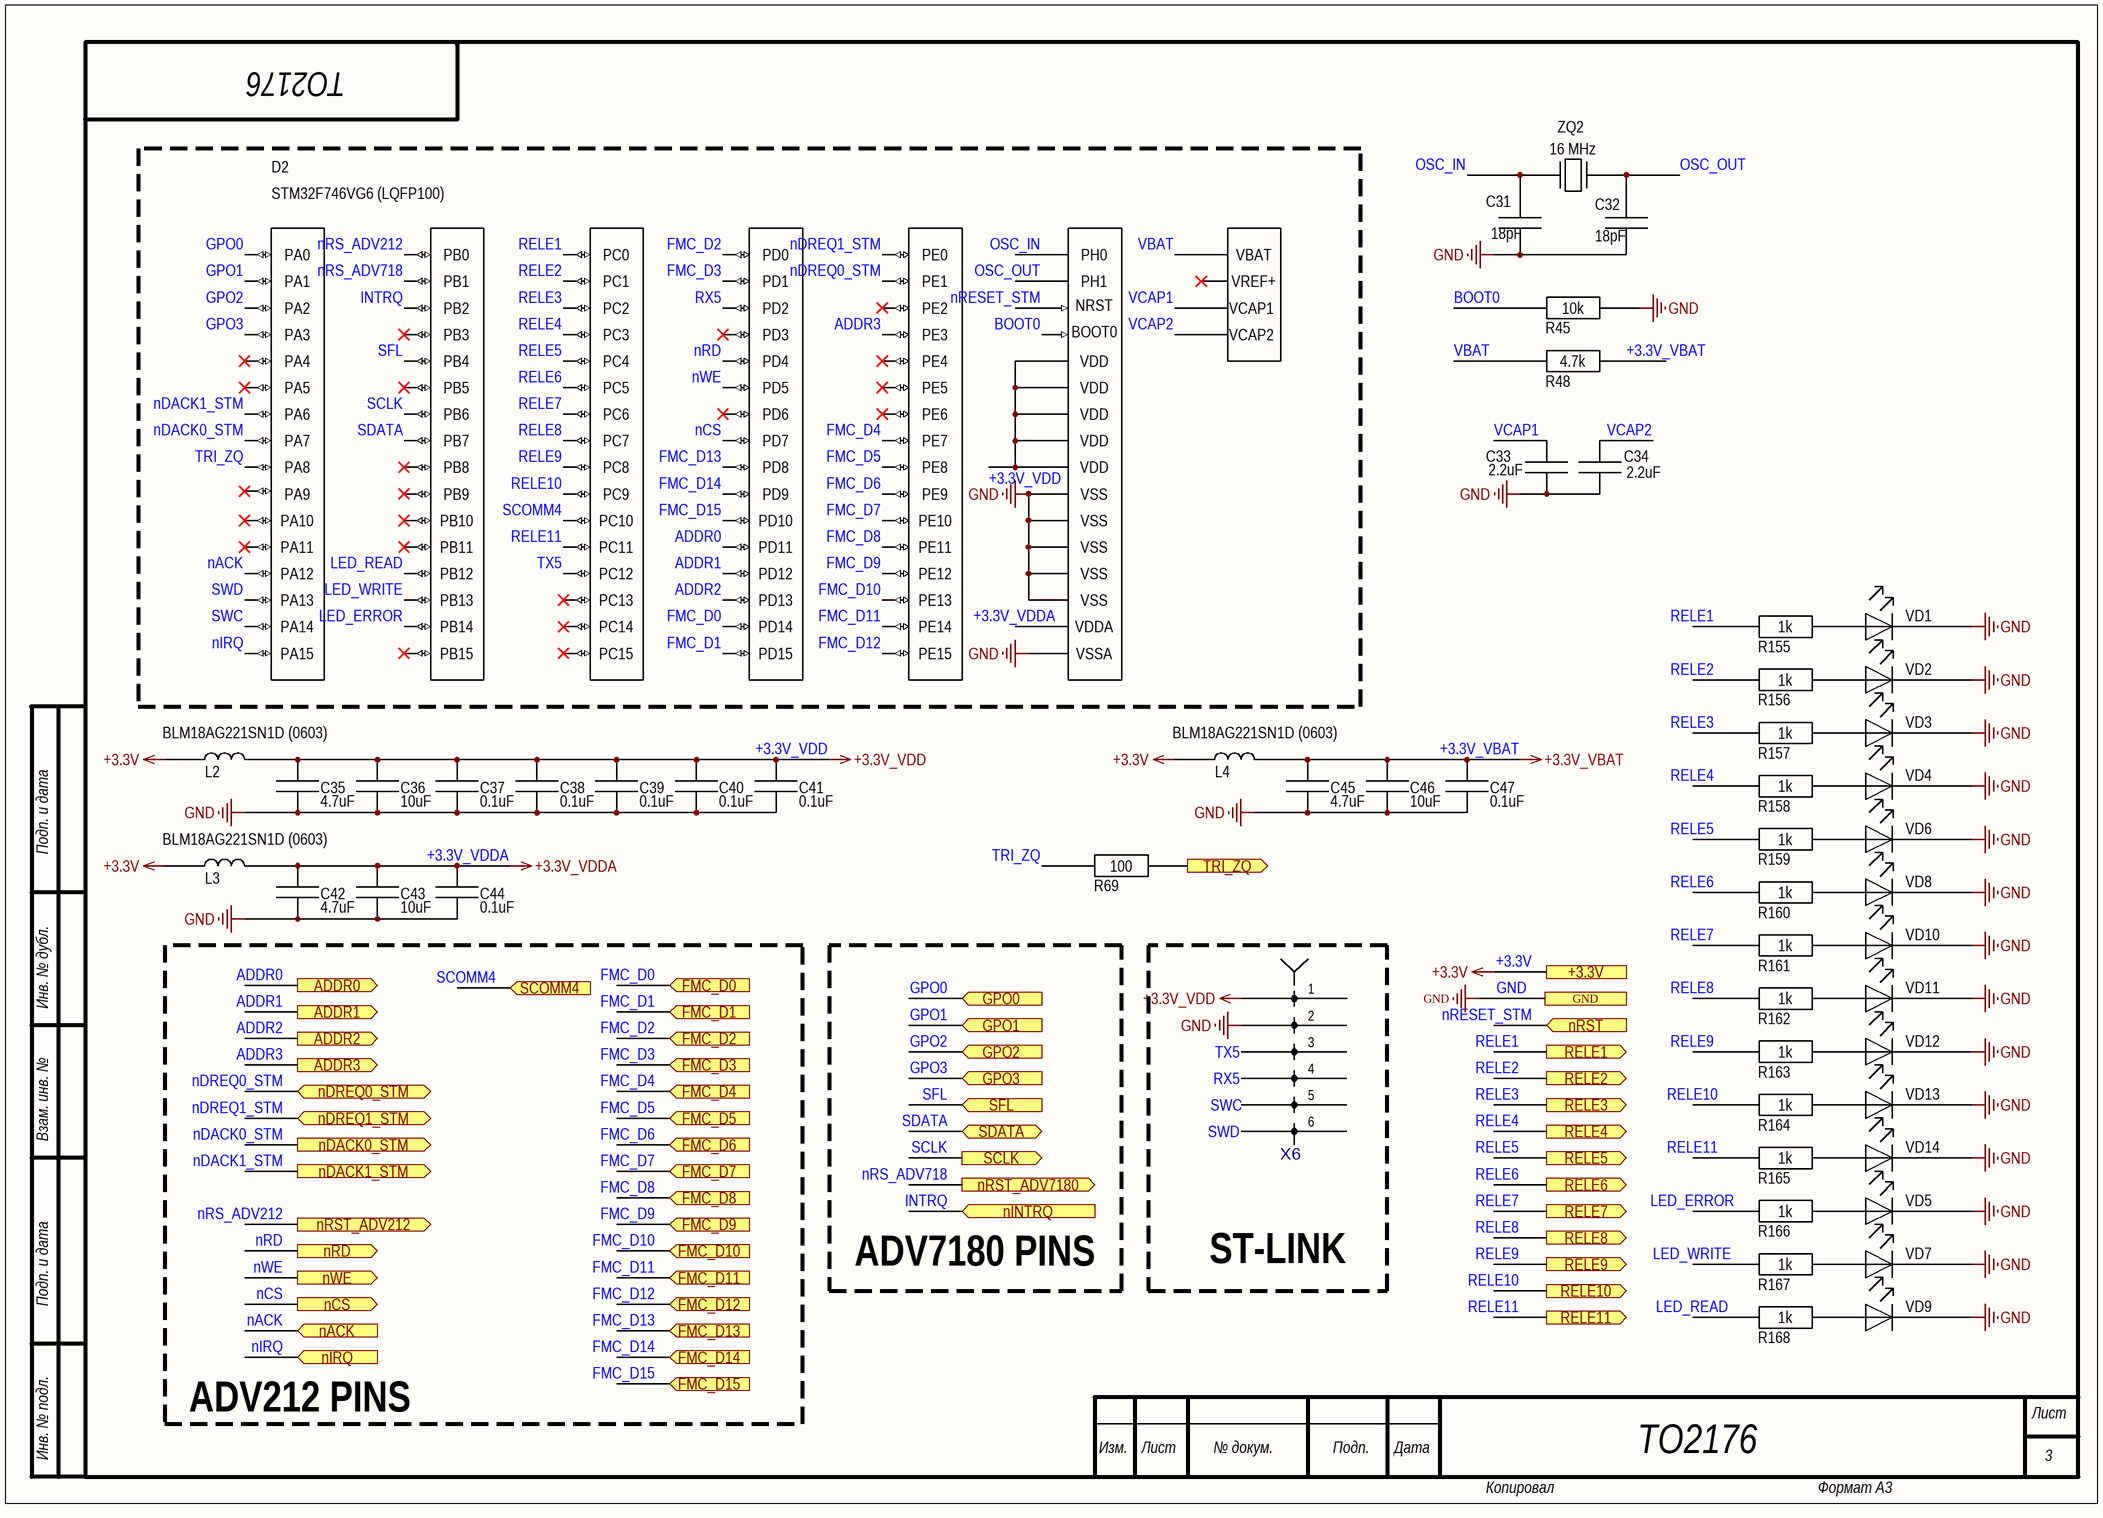
[diagram p3: STM32.SchDoc]

### Parts
C31  18pF  [0603]
C32  18pF  [0603]
C33  2.2uF  [0603]
C34  2.2uF  [0603]
C35  4.7uF  [0603]
C36  10uF  [0603]
C37  0.1uF  [0603]
C38  0.1uF  [0603]
C39  0.1uF  [0603]
C40  0.1uF  [0603]
C41  0.1uF  [0603]
C42  4.7uF  [0603]
C43  10uF  [0603]
C44  0.1uF  [0603]
C45  4.7uF  [0603]
C46  10uF  [0603]
C47  0.1uF  [0603]
D2  STM32F746VG6 (LQFP100)  [LQFP-100]
L2  BLM18AG221SN1D (0603)  [0805]
L3  BLM18AG221SN1D (0603)  [0805]
L4  BLM18AG221SN1D (0603)  [0805]
R45  10k  [0603]
R48  4.7k  [0603]
R69  100  [0603]
R155  1k  [0603]
R156  1k  [0603]
R157  1k  [0603]
R158  1k  [0603]
R159  1k  [0603]
R160  1k  [0603]
R161  1k  [0603]
R162  1k  [0603]
R163  1k  [0603]
R164  1k  [0603]
R165  1k  [0603]
R166  1k  [0603]
R167  1k  [0603]
R168  1k  [0603]
VD1  LED(0805)  [0805(LED)]  (value not drawn)
VD2  LED(0805)  [0805(LED)]  (value not drawn)
VD3  LED(0805)  [0805(LED)]  (value not drawn)
VD4  LED(0805)  [0805(LED)]  (value not drawn)
VD5  LED(0805)  [0805(LED)]  (value not drawn)
VD6  LED(0805)  [0805(LED)]  (value not drawn)
VD7  LED(0805)  [0805(LED)]  (value not drawn)
VD8  LED(0805)  [0805(LED)]  (value not drawn)
VD9  LED(0805)  [0805(LED)]  (value not drawn)
VD10  LED(0805)  [0805(LED)]  (value not drawn)
VD11  LED(0805)  [0805(LED)]  (value not drawn)
VD12  LED(0805)  [0805(LED)]  (value not drawn)
VD13  LED(0805)  [0805(LED)]  (value not drawn)
VD14  LED(0805)  [0805(LED)]  (value not drawn)
X6  PLS6-2,54  [PLS6-2,54]  (value not drawn)
ZQ2  16 MHz  [HC-49SM]

### Blocks framed on the sheet
ST-LINK: X6

### Ports
+3.3V, ADDR0 (out), ADDR1 (out), ADDR2 (out), ADDR3 (out), FMC_D0 (in), FMC_D1 (in), FMC_D2 (in), FMC_D3 (in), FMC_D4 (in), FMC_D5 (in), FMC_D6 (in), FMC_D7 (in), FMC_D8 (in), FMC_D9 (in), FMC_D10 (in), FMC_D11 (in), FMC_D12 (in), FMC_D13 (in), FMC_D14 (in), FMC_D15 (in), GND, GPO0 (in), GPO1 (in), GPO2 (in), GPO3 (in), nACK (in), nCS (out), nDACK0_STM (out), nDACK1_STM (out), nDREQ0_STM (bidir), nDREQ1_STM (bidir), nINTRQ (in), nIRQ (in), nRD (out), nRST (in), nRST_ADV212 (out), nRST_ADV7180 (out), nWE (out), RELE1 (out), RELE2 (out), RELE3 (out), RELE4 (out), RELE5 (out), RELE6 (out), RELE7 (out), RELE8 (out), RELE9 (out), RELE10 (out), RELE11 (out), SCLK (out), SCOMM4 (in), SDATA (bidir), SFL (in), TRI_ZQ (out)

### Nets
+3.3V: L2.1 L3.1 L4.1 ; port +3.3V
+3.3V_VBAT: C45.2 C46.2 C47.2 L4.2 R48.2
+3.3V_VDD: C35.2 C36.2 C37.2 C38.2 C39.2 C40.2 C41.2 D2.11 D2.27 D2.50 D2.75 D2.100 L2.2 X6.1
+3.3V_VDDA: C42.2 C43.2 C44.2 D2.21 L3.2
GND: C31.2 C32.2 C33.1 C34.1 C35.1 C36.1 C37.1 C38.1 C39.1 C40.1 C41.1 C42.1 C43.1 C44.1 C45.1 C46.1 C47.1 D2.10 D2.19 D2.26 D2.49 D2.74 D2.99 R45.2 VD1.2(K) VD2.2(K) VD3.2(K) VD4.2(K) VD5.2(K) VD6.2(K) VD7.2(K) VD8.2(K) VD9.2(K) VD10.2(K) VD11.2(K) VD12.2(K) VD13.2(K) VD14.2(K) X6.2 ; port GND
ADDR0: D2.58 ; port ADDR0
ADDR1: D2.59 ; port ADDR1
ADDR2: D2.60 ; port ADDR2
ADDR3: D2.2 ; port ADDR3
BOOT0: D2.94 R45.1  [project net BOOT0_3]
FMC_D0: D2.61 ; port FMC_D0
FMC_D1: D2.62 ; port FMC_D1
FMC_D2: D2.81 ; port FMC_D2
FMC_D3: D2.82 ; port FMC_D3
FMC_D4: D2.37 ; port FMC_D4
FMC_D5: D2.38 ; port FMC_D5
FMC_D6: D2.39 ; port FMC_D6
FMC_D7: D2.40 ; port FMC_D7
FMC_D8: D2.41 ; port FMC_D8
FMC_D9: D2.42 ; port FMC_D9
FMC_D10: D2.43 ; port FMC_D10
FMC_D11: D2.44 ; port FMC_D11
FMC_D12: D2.45 ; port FMC_D12
FMC_D13: D2.55 ; port FMC_D13
FMC_D14: D2.56 ; port FMC_D14
FMC_D15: D2.57 ; port FMC_D15
GPO0: D2.22 ; port GPO0
GPO1: D2.23 ; port GPO1
GPO2: D2.24 ; port GPO2
GPO3: D2.25 ; port GPO3
INTRQ: D2.36 ; port nINTRQ
LED_ERROR: D2.53 R166.1  [project net LED_ERROR_3]
LED_READ: D2.51 R168.1  [project net LED_READ_3]
LED_WRITE: D2.52 R167.1  [project net LED_WRITE_3]
nACK: D2.71 ; port nACK
nCS: D2.88 ; port nCS
nDACK0_STM: D2.31 ; port nDACK0_STM
nDACK1_STM: D2.30 ; port nDACK1_STM
nDREQ0_STM: D2.98 ; port nDREQ0_STM
nDREQ1_STM: D2.97 ; port nDREQ1_STM
nIRQ: D2.77 ; port nIRQ
nRD: D2.85 ; port nRD
nRESET_STM: D2.14 ; port nRST
nRS_ADV212: D2.34 ; port nRST_ADV212
nRS_ADV718: D2.35 ; port nRST_ADV7180
nWE: D2.86 ; port nWE
OSC_IN: C31.1 D2.12 ZQ2.1  [project net OSC_IN_3]
OSC_OUT: C32.1 D2.13 ZQ2.2  [project net OSC_OUT_3]
RELE1: D2.15 R155.1 ; port RELE1
RELE2: D2.16 R156.1 ; port RELE2
RELE3: D2.17 R157.1 ; port RELE3
RELE4: D2.18 R158.1 ; port RELE4
RELE5: D2.32 R159.1 ; port RELE5
RELE6: D2.33 R160.1 ; port RELE6
RELE7: D2.63 R161.1 ; port RELE7
RELE8: D2.64 R162.1 ; port RELE8
RELE9: D2.65 R163.1 ; port RELE9
RELE10: D2.66 R164.1 ; port RELE10
RELE11: D2.79 R165.1 ; port RELE11
RX5: D2.83 X6.4  [project net RX5_3]
SCLK: D2.92 ; port SCLK
SCOMM4: D2.78 ; port SCOMM4
SDATA: D2.93 ; port SDATA
SFL: D2.90 ; port SFL
SWC: D2.76 X6.5  [project net SWC_3]
SWD: D2.72 X6.6  [project net SWD_3]
TRI_ZQ: R69.2 ; port TRI_ZQ
TRI_ZQ: D2.67 R69.1  [project net TRI_ZQ_3]  [a separate net that carries the same name]
TX5: D2.80 X6.3  [project net TX5_3]
VBAT: D2.6 R48.1  [project net VBAT_3]
VCAP1: C33.2 D2.48  [project net VCAP1_3]
VCAP2: C34.2 D2.73  [project net VCAP2_3]
NetR155_2: R155.2 VD1.1(A)
NetR156_2: R156.2 VD2.1(A)
NetR157_2: R157.2 VD3.1(A)
NetR158_2: R158.2 VD4.1(A)
NetR159_2: R159.2 VD6.1(A)
NetR160_2: R160.2 VD8.1(A)
NetR161_2: R161.2 VD10.1(A)
NetR162_2: R162.2 VD11.1(A)
NetR163_2: R163.2 VD12.1(A)
NetR164_2: R164.2 VD13.1(A)
NetR165_2: R165.2 VD14.1(A)
NetR166_2: R166.2 VD5.1(A)
NetR167_2: R167.2 VD7.1(A)
NetR168_2: R168.2 VD9.1(A)

Not connected (* = marked no-connect by the designer): D2 1* 3* 4* 5* 7* 8* 9* 20* 28* 29* 46* 47* 54* 68* 69* 70* 84* 87* 89* 91* 95* 96*

### Notes on the sheet
- ТО2176
- Подп. и дата
- Инв. № дубл.
- Взам. инв. №
- ADV7180 PINS
- ADV212 PINS
- Инв. № подл.
- Изм.
- Лист
- № докум.
- Подп.
- Дата
- 3
- Копировал
- Формат А3
- (in symbol STM32F746VG6) PA0; PB0; PC0; PD0; PE0; PH0; VBAT; PA1; PB1; PC1; PD1; PE1; PH1; VREF+; NRST; PA2; PB2; PC2; PD2; PE2; VCAP1; BOOT0; PA3; PB3; PC3; PD3; PE3; VCAP2; PA4; PB4; PC4; PD4; PE4; VDD; PA5; PB5; PC5; PD5; PE5; PA6; PB6; PC6; PD6; PE6; PA7; PB7; PC7; PD7; PE7; PA8; PB8; PC8; PD8; PE8; PA9; PB9; PC9; PD9; PE9; VSS; PA10; PB10; PC10; PD10; PE10; PA11; PB11; PC11; PD11; PE11; PA12; PB12; PC12; PD12; PE12; PA13; PB13; PC13; PD13; PE13; PA14; PB14; PC14; PD14; PE14; VDDA; PA15; PB15; PC15; PD15; PE15; VSSA

### Library data of the parts
C31-C47 = C0603: as C48 on sheet Main; ClassName: *; Component Link: *; ComponentWeigt: *; Packaging: 0805; NN: *; Value: *
D2 = STM32F746VG6
L2-L4 = BLM21(0805) Murata: as L1 on sheet ADV212; ClassName: *; Component Link: *; ComponentWeigt: *; Packaging: 1206; NN: *; KIND: *
R45 R48 R69 R155-R168 = R0603 Yageo: as R49 on sheet Main; Packaging: 0402; ClassName: *; Component Link: *; NN: *
VD1-VD14 = LED(0805): ComponentHeigt: 0.75; Leadform: в отверстия; Firme: Kingbright; NN: 24003000; KIND: Светодиод L-1154GD Kingbright; Component Link: *; ClassName: *
X6 = PLS6-2,54: ComponentHeigt: 5.5; Name: Вилка; Specification: Вилка PLD2-2 *; Typ: PLD2-2; ClassName: *; Component Link: *; ComponentWeigt: *; Firme: *; Leadform: *; NN: *; KIND: *
ZQ2 = HC-49SM

## Sheet FORMULA.SchDoc
size A4; SheetNumber: 4; SheetTotal: 8
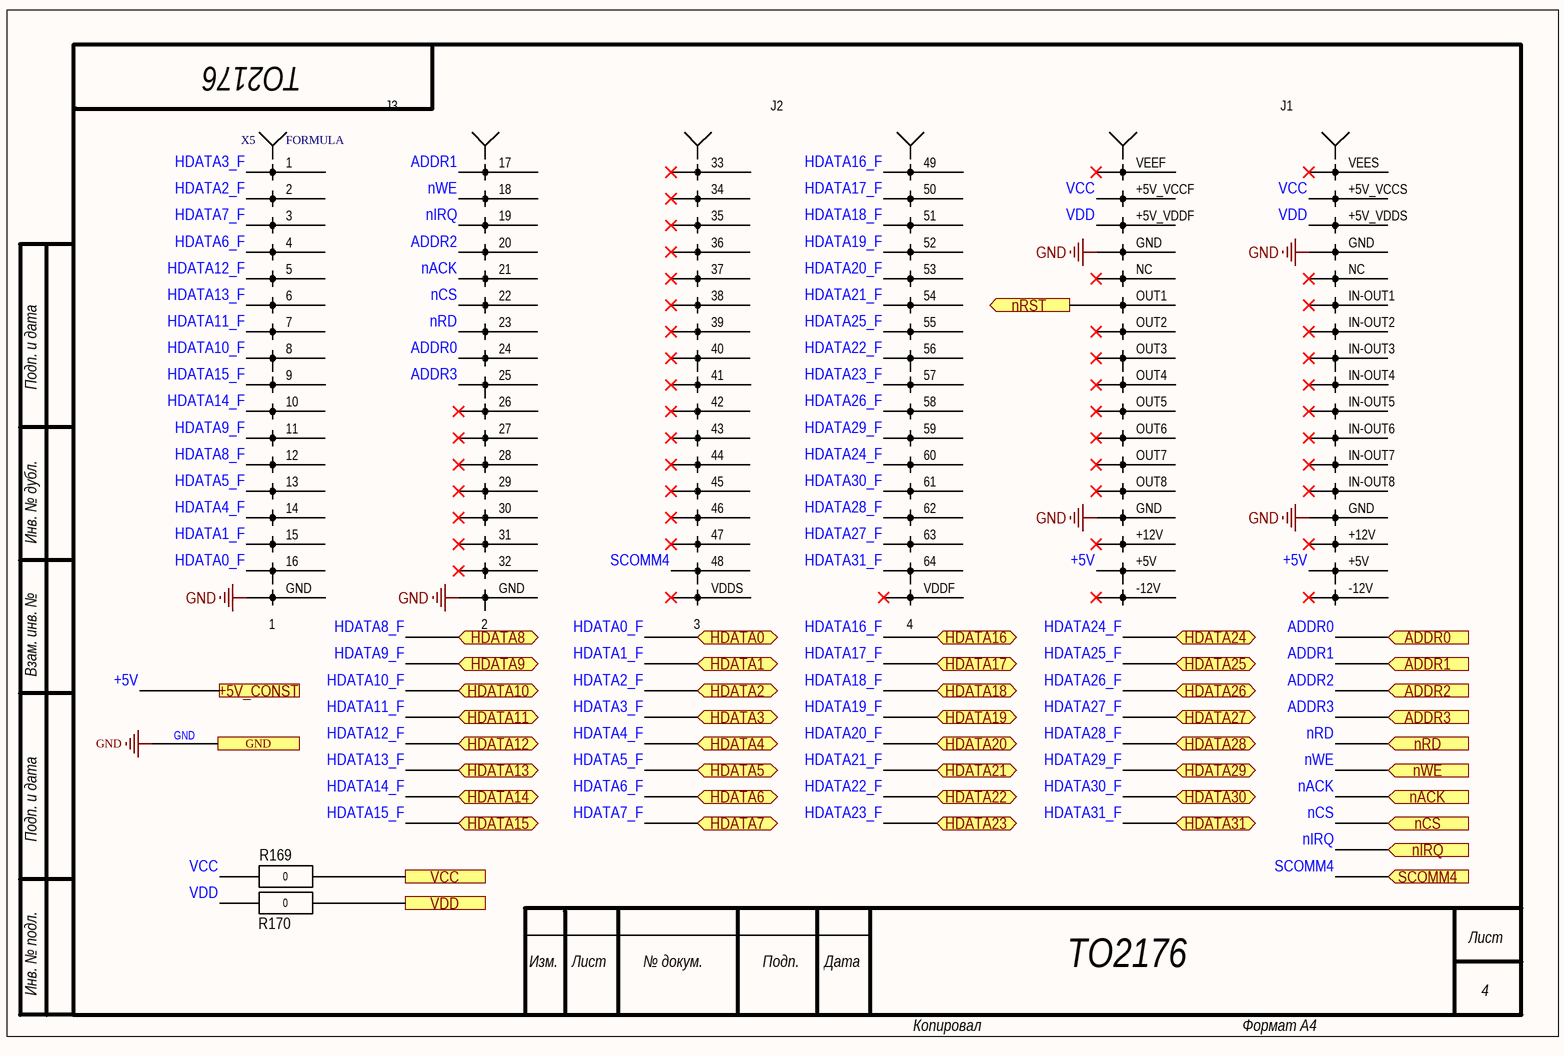
[diagram p4: FORMULA.SchDoc]

### Parts
R169  0  [0603]
R170  0  [0603]
X5  FORMULA  [FORMULA]

### Ports
+5V_CONST, ADDR0 (in), ADDR1 (in), ADDR2 (in), ADDR3 (in), GND, HDATA0 (bidir), HDATA1 (bidir), HDATA2 (bidir), HDATA3 (bidir), HDATA4 (bidir), HDATA5 (bidir), HDATA6 (bidir), HDATA7 (bidir), HDATA8 (bidir), HDATA9 (bidir), HDATA10 (bidir), HDATA11 (bidir), HDATA12 (bidir), HDATA13 (bidir), HDATA14 (bidir), HDATA15 (bidir), HDATA16 (bidir), HDATA17 (bidir), HDATA18 (bidir), HDATA19 (bidir), HDATA20 (bidir), HDATA21 (bidir), HDATA22 (bidir), HDATA23 (bidir), HDATA24 (bidir), HDATA25 (bidir), HDATA26 (bidir), HDATA27 (bidir), HDATA28 (bidir), HDATA29 (bidir), HDATA30 (bidir), HDATA31 (bidir), nACK (in), nCS (in), nIRQ (in), nRD (in), nRST (out), nWE (in), SCOMM4 (in), VCC, VDD

### Nets
+1.5V: R169.2 ; port VCC
+3.3V: R170.2 ; port VDD
GND: X5.GND ; port GND
+5V: X5.+5V ; port +5V_CONST
ADDR0: X5.24 ; port ADDR0
ADDR1: X5.17 ; port ADDR1
ADDR2: X5.20 ; port ADDR2
ADDR3: X5.25 ; port ADDR3
HDATA0_F: X5.16 ; port HDATA0
HDATA1_F: X5.15 ; port HDATA1
HDATA2_F: X5.2 ; port HDATA2
HDATA3_F: X5.1 ; port HDATA3
HDATA4_F: X5.14 ; port HDATA4
HDATA5_F: X5.13 ; port HDATA5
HDATA6_F: X5.4 ; port HDATA6
HDATA7_F: X5.3 ; port HDATA7
HDATA8_F: X5.12 ; port HDATA8
HDATA9_F: X5.11 ; port HDATA9
HDATA10_F: X5.8 ; port HDATA10
HDATA11_F: X5.7 ; port HDATA11
HDATA12_F: X5.5 ; port HDATA12
HDATA13_F: X5.6 ; port HDATA13
HDATA14_F: X5.10 ; port HDATA14
HDATA15_F: X5.9 ; port HDATA15
HDATA16_F: X5.49 ; port HDATA16  [project net HDATA16]
HDATA17_F: X5.50 ; port HDATA17  [project net HDATA17]
HDATA18_F: X5.51 ; port HDATA18  [project net HDATA18]
HDATA19_F: X5.52 ; port HDATA19  [project net HDATA19]
HDATA20_F: X5.53 ; port HDATA20  [project net HDATA20]
HDATA21_F: X5.54 ; port HDATA21  [project net HDATA21]
HDATA22_F: X5.56 ; port HDATA22  [project net HDATA22]
HDATA23_F: X5.57 ; port HDATA23  [project net HDATA23]
HDATA24_F: X5.60 ; port HDATA24  [project net HDATA24]
HDATA25_F: X5.55 ; port HDATA25  [project net HDATA25]
HDATA26_F: X5.58 ; port HDATA26  [project net HDATA26]
HDATA27_F: X5.63 ; port HDATA27  [project net HDATA27]
HDATA28_F: X5.62 ; port HDATA28  [project net HDATA28]
HDATA29_F: X5.59 ; port HDATA29  [project net HDATA29]
HDATA30_F: X5.61 ; port HDATA30  [project net HDATA30]
HDATA31_F: X5.64 ; port HDATA31  [project net HDATA31]
nACK: X5.21 ; port nACK
nCS: X5.22 ; port nCS
nIRQ: X5.19 ; port nIRQ
nRD: X5.23 ; port nRD
nWE: X5.18 ; port nWE
RST_F: X5.OUT1 ; port nRST
SCOMM4: X5.48 ; port SCOMM4
VCC: R169.1 X5.+5V_VCCF(VCCF) X5.+5V_VCCS(VCCS)  [project net VCC_4]
VDD: R170.1 X5.+5V_VDDF(VDDF) X5.+5V_VDDS(VDDS)  [project net VDD_4]

Not connected (* = marked no-connect by the designer): X5 26* 27* 28* 29* 30* 31* 32* 33* 34* 35* 36(4)* 37(5)* 38* 39* 40* 41* 42* 43* 44* 45* 46* 47* +12V* -12V* IN-OUT1* IN-OUT2* IN-OUT3* IN-OUT4* IN-OUT5* IN-OUT6* IN-OUT7* IN-OUT8* NC* OUT2* OUT3* OUT4* OUT5* OUT6* OUT7* OUT8* VDDF* VDDS* VEEF* VEES*

### Notes on the sheet
- ТО2176
- Подп. и дата
- Инв. № дубл.
- Взам. инв. №
- Инв. № подл.
- Изм.
- Лист
- № докум.
- Подп.
- Дата
- 4
- Копировал
- Формат А4
- (in symbol FORMULA) J3; J2; J1

### Library data of the parts
R169 R170 = R0603 Yageo: as R49 on sheet Main; Packaging: 0402; ClassName: *; Component Link: *; NN: *

## Sheet ADV7180.SchDoc
size A3; SheetNumber: 5; SheetTotal: 8
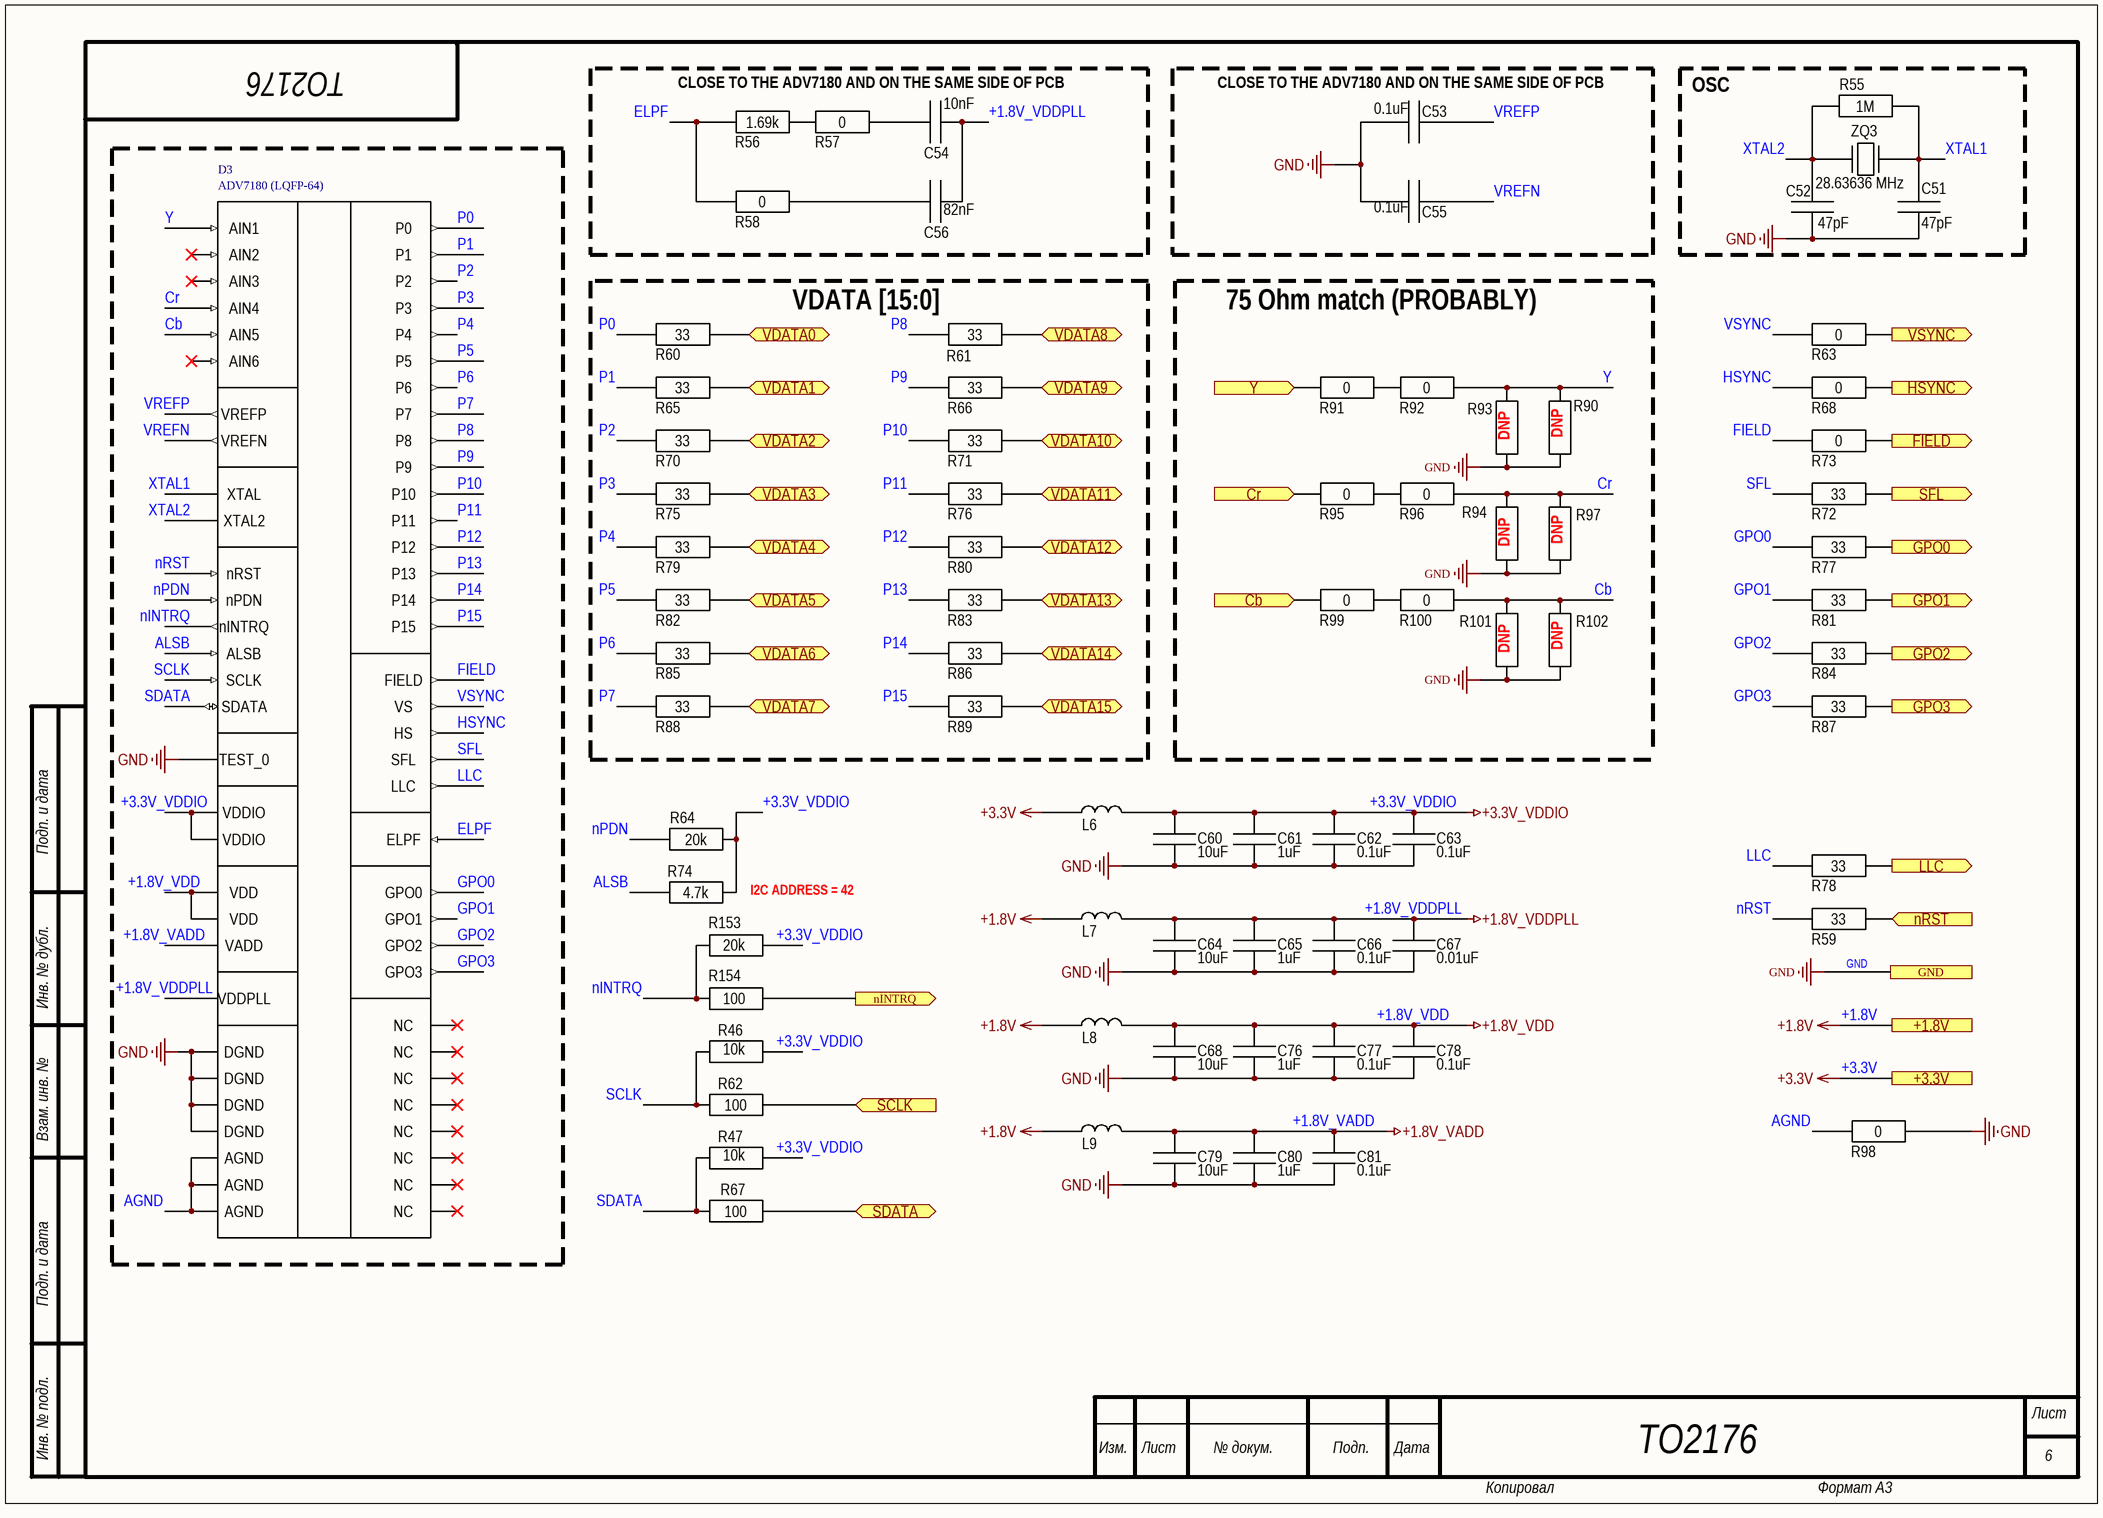
[diagram p5: ADV7180.SchDoc]

### Parts
C51  47pF  [0603]
C52  47pF  [0603]
C53  0.1uF  [0603]
C54  10nF  [0603]
C55  0.1uF  [0603]
C56  82nF  [0603]
C60  10uF  [0603]
C61  1uF  [0603]
C62  0.1uF  [0603]
C63  0.1uF  [0603]
C64  10uF  [0603]
C65  1uF  [0603]
C66  0.1uF  [0603]
C67  0.01uF  [0603]
C68  10uF  [0603]
C76  1uF  [0603]
C77  0.1uF  [0603]
C78  0.1uF  [0603]
C79  10uF  [0603]
C80  1uF  [0603]
C81  0.1uF  [0603]
D3  ADV7180 (LQFP-64)  [LQFP-64]
L6  BLM18AG221SN1D (0603)  [0805]  (value not drawn)
L7  BLM18AG221SN1D (0603)  [0805]  (value not drawn)
L8  BLM18AG221SN1D (0603)  [0805]  (value not drawn)
L9  BLM18AG221SN1D (0603)  [0805]  (value not drawn)
R46  10k  [0603]
R47  10k  [0603]
R55  1M  [0603]
R56  1.69k  [0603]
R57  0  [0603]
R58  0  [0603]
R59  33  [0603]
R60  33  [0603]
R61  33  [0603]
R62  100  [0603]
R63  0  [0603]
R64  20k  [0603]
R65  33  [0603]
R66  33  [0603]
R67  100  [0603]
R68  0  [0603]
R70  33  [0603]
R71  33  [0603]
R72  33  [0603]
R73  0  [0603]
R74  4.7k  [0603]
R75  33  [0603]
R76  33  [0603]
R77  33  [0603]
R78  33  [0603]
R79  33  [0603]
R80  33  [0603]
R81  33  [0603]
R82  33  [0603]
R83  33  [0603]
R84  33  [0603]
R85  33  [0603]
R86  33  [0603]
R87  33  [0603]
R88  33  [0603]
R89  33  [0603]
R90  DNP  [0805]
R91  0  [0805]
R92  0  [0603]
R93  DNP  [0603]
R94  DNP  [0603]
R95  0  [0805]
R96  0  [0603]
R97  DNP  [0805]
R98  0  [0603]
R99  0  [0805]
R100  0  [0603]
R101  DNP  [0603]
R102  DNP  [0805]
R153  20k  [0603]
R154  100  [0603]
ZQ3  28.63636 MHz  [ABM3]

### Blocks framed on the sheet
CLOSE TO THE ADV7180 AND ON THE SAME SIDE OF PCB: C54 C56 R56-R58
CLOSE TO THE ADV7180 AND ON THE SAME SIDE OF PCB: C53 C55
OSC: C51 C52 R55 ZQ3
VDATA [15:0]: R60 R61 R65 R66 R70 R71 R75 R76 R79 R80 R82 R83 R85 R86 R88 R89

### Ports
+1.8V, +3.3V, Cb (in), Cr (in), FIELD (out), GND, GPO0 (out), GPO1 (out), GPO2 (out), GPO3 (out), HSYNC (out), LLC (out), nINTRQ (out), nRST (in), SCLK (in), SDATA (bidir), SFL (out), VDATA0 (bidir), VDATA1 (bidir), VDATA2 (bidir), VDATA3 (bidir), VDATA4 (bidir), VDATA5 (bidir), VDATA6 (bidir), VDATA7 (bidir), VDATA8 (bidir), VDATA9 (bidir), VDATA10 (bidir), VDATA11 (bidir), VDATA12 (bidir), VDATA13 (bidir), VDATA14 (bidir), VDATA15 (bidir), VSYNC (out), Y (in)

### Nets
+1.8V: L7.1 L8.1 L9.1 ; port +1.8V
+1.8V_VADD: C79.2 C80.2 C81.2 D3.40 L9.2
+1.8V_VDD: C68.2 C76.2 C77.2 C78.2 D3.23 D3.58 L8.2
+1.8V_VDDPLL: C54.2 C56.2 C64.2 C65.2 C66.2 C67.2 D3.31 L7.2
+3.3V: L6.1 ; port +3.3V
+3.3V_VDDIO: C60.2 C61.2 C62.2 C63.2 D3.4 D3.11 L6.2 R46.2 R47.2 R64.2 R74.2 R153.2
GND: C51.2 C52.2 C53.1 C55.1 C60.1 C61.1 C62.1 C63.1 C64.1 C65.1 C66.1 C67.1 C68.1 C76.1 C77.1 C78.1 C79.1 C80.1 C81.1 D3.3 D3.10 D3.24 D3.34 D3.57 R90.1 R93.1 R94.1 R97.1 R98.2 R101.1 R102.1 ; port GND
AGND: D3.32 D3.37 D3.43 R98.1  [project net AGND_5]
ALSB: D3.52 R74.1  [project net ALSB_5]
Cb: R99.1 ; port Cb
Cb: D3.48 R100.2 R101.2 R102.2  [project net Cb_5]  [a separate net that carries the same name]
Cr: R95.1 ; port Cr
Cr: D3.47 R94.2 R96.2 R97.2  [project net Cr_5]  [a separate net that carries the same name]
ELPF: D3.30 R56.1 R58.1  [project net ELPF_5]
FIELD: R73.2 ; port FIELD
FIELD: D3.63 R73.1  [project net FIELD_5]  [a separate net that carries the same name]
GPO0: R77.2 ; port GPO0
GPO0: D3.13 R77.1  [project net GPO0_5]  [a separate net that carries the same name]
GPO1: R81.2 ; port GPO1
GPO1: D3.12 R81.1  [project net GPO1_5]  [a separate net that carries the same name]
GPO2: R84.2 ; port GPO2
GPO2: D3.56 R84.1  [project net GPO2_5]  [a separate net that carries the same name]
GPO3: R87.2 ; port GPO3
GPO3: D3.55 R87.1  [project net GPO3_5]  [a separate net that carries the same name]
HDATA16: R80.2 ; port VDATA12
HDATA17: R83.2 ; port VDATA13
HDATA18: R86.2 ; port VDATA14
HDATA19: R89.2 ; port VDATA15
HSYNC: R68.2 ; port HSYNC
HSYNC: D3.2 R68.1  [project net HSYNC_5]  [a separate net that carries the same name]
INTRQ: R154.1 ; port nINTRQ
LLC: D3.20 R78.1  [project net LLC_5]
nINTRQ: D3.1 R153.1 R154.2  [project net nINTRQ_5]
nPDN: D3.29 R64.1  [project net nPDN_5]
nRST: D3.51 R59.1  [project net nRST_5]
nRST_ADV7180: R59.2 ; port nRST
P0: D3.26 R60.1  [project net P0_5]
P1: D3.25 R65.1  [project net P1_5]
P2: D3.19 R70.1  [project net P2_5]
P3: D3.18 R75.1  [project net P3_5]
P4: D3.17 R79.1  [project net P4_5]
P5: D3.16 R82.1  [project net P5_5]
P6: D3.15 R85.1  [project net P6_5]
P7: D3.14 R88.1  [project net P7_5]
P8: D3.8 R61.1  [project net P8_5]
P9: D3.7 R66.1  [project net P9_5]
P10: D3.6 R71.1  [project net P10_5]
P11: D3.5 R76.1  [project net P11_5]
P12: D3.62 R80.1  [project net P12_5]
P13: D3.61 R83.1  [project net P13_5]
P14: D3.60 R86.1  [project net P14_5]
P15: D3.59 R89.1  [project net P15_5]
SCLK: R62.2 ; port SCLK
SCLK: D3.54 R46.1 R62.1  [project net SCLK_5]  [a separate net that carries the same name]
SDATA: R67.2 ; port SDATA
SDATA: D3.53 R47.1 R67.1  [project net SDATA_5]  [a separate net that carries the same name]
SFL: R72.2 ; port SFL
SFL: D3.9 R72.1  [project net SFL_5]  [a separate net that carries the same name]
VCLK: R78.2 ; port LLC
VDATA0: R60.2 ; port VDATA0
VDATA1: R65.2 ; port VDATA1
VDATA2: R70.2 ; port VDATA2
VDATA3: R75.2 ; port VDATA3
VDATA4: R79.2 ; port VDATA4
VDATA5: R82.2 ; port VDATA5
VDATA6: R85.2 ; port VDATA6
VDATA7: R88.2 ; port VDATA7
VDATA8: R61.2 ; port VDATA8
VDATA9: R66.2 ; port VDATA9
VDATA10: R71.2 ; port VDATA10
VDATA11: R76.2 ; port VDATA11
VREFN: C55.2 D3.39  [project net VREFN_5]
VREFP: C53.2 D3.38  [project net VREFP_5]
VSYNC: R63.2 ; port VSYNC
VSYNC: D3.64 R63.1  [project net VSYNC_5]  [a separate net that carries the same name]
XTAL1: C51.1 D3.21 R55.2 ZQ3.2  [project net XTAL1_5]
XTAL2: C52.1 D3.22 R55.1 ZQ3.1  [project net XTAL2_5]
Y: R91.1 ; port Y
Y: D3.35 R90.2 R92.2 R93.2  [project net Y_5]  [a separate net that carries the same name]
NetC54_1: C54.1 R57.2
NetC56_1: C56.1 R58.2
NetR56_2: R56.2 R57.1
NetR91_2: R91.2 R92.1
NetR95_2: R95.2 R96.1
NetR99_2: R99.2 R100.1

Not connected (* = marked no-connect by the designer): D3 27* 28* 33* 36* 41* 42* 44* 45* 46* 49* 50*

### Notes on the sheet
- ТО2176
- 75 Ohm match (PROBABLY)
- Подп. и дата
- (near R74) I2C ADDRESS = 42
- Инв. № дубл.
- Взам. инв. №
- Инв. № подл.
- Изм.
- Лист
- № докум.
- Подп.
- Дата
- 6
- Копировал
- Формат А3
- (in symbol ADV7180 (LQFP-64)) AIN1; P0; AIN2; P1; AIN3; P2; AIN4; P3; AIN5; P4; AIN6; P5; P6; VREFP; P7; VREFN; P8; P9; XTAL; P10; XTAL2; P11; P12; nRST; P13; nPDN; P14; nINTRQ; P15; ALSB; SCLK; FIELD; SDATA; VS; HS; TEST_0; SFL; LLC; VDDIO; ELPF; VDD; GPO0; GPO1; VADD; GPO2; GPO3; VDDPLL; NC; DGND; AGND

### Library data of the parts
C51-C56 C60-C68 C76-C81 = C0603: as C48 on sheet Main; ClassName: *; Component Link: *; ComponentWeigt: *; Packaging: 0805; NN: *; Value: *
L6-L9 = BLM21(0805) Murata: as L1 on sheet ADV212; ClassName: *; Component Link: *; ComponentWeigt: *; Packaging: 1206; NN: *; KIND: *
R46 R47 R55-R68 R70-R89 R92-R94 R96 R98 R100 R101 R153 R154 = R0603 Yageo: as R49 on sheet Main; Packaging: 0402; ClassName: *; Component Link: *; NN: *
R90 R91 R95 R97 R99 R102 = R0805 Yageo: ComponentHeigt: 0.6; Firme: Yageo; Leadform: SMD; Kind: Резистор; ClassName: *; ComponentWeigt: *; Component Link: *; Packaging: 0805; NN: *; Value: *
ZQ3 = ABM3: ABM3-28.63636MHZ

## Sheet RELE.SchDoc
size A3; SheetNumber: 6; SheetTotal: 8
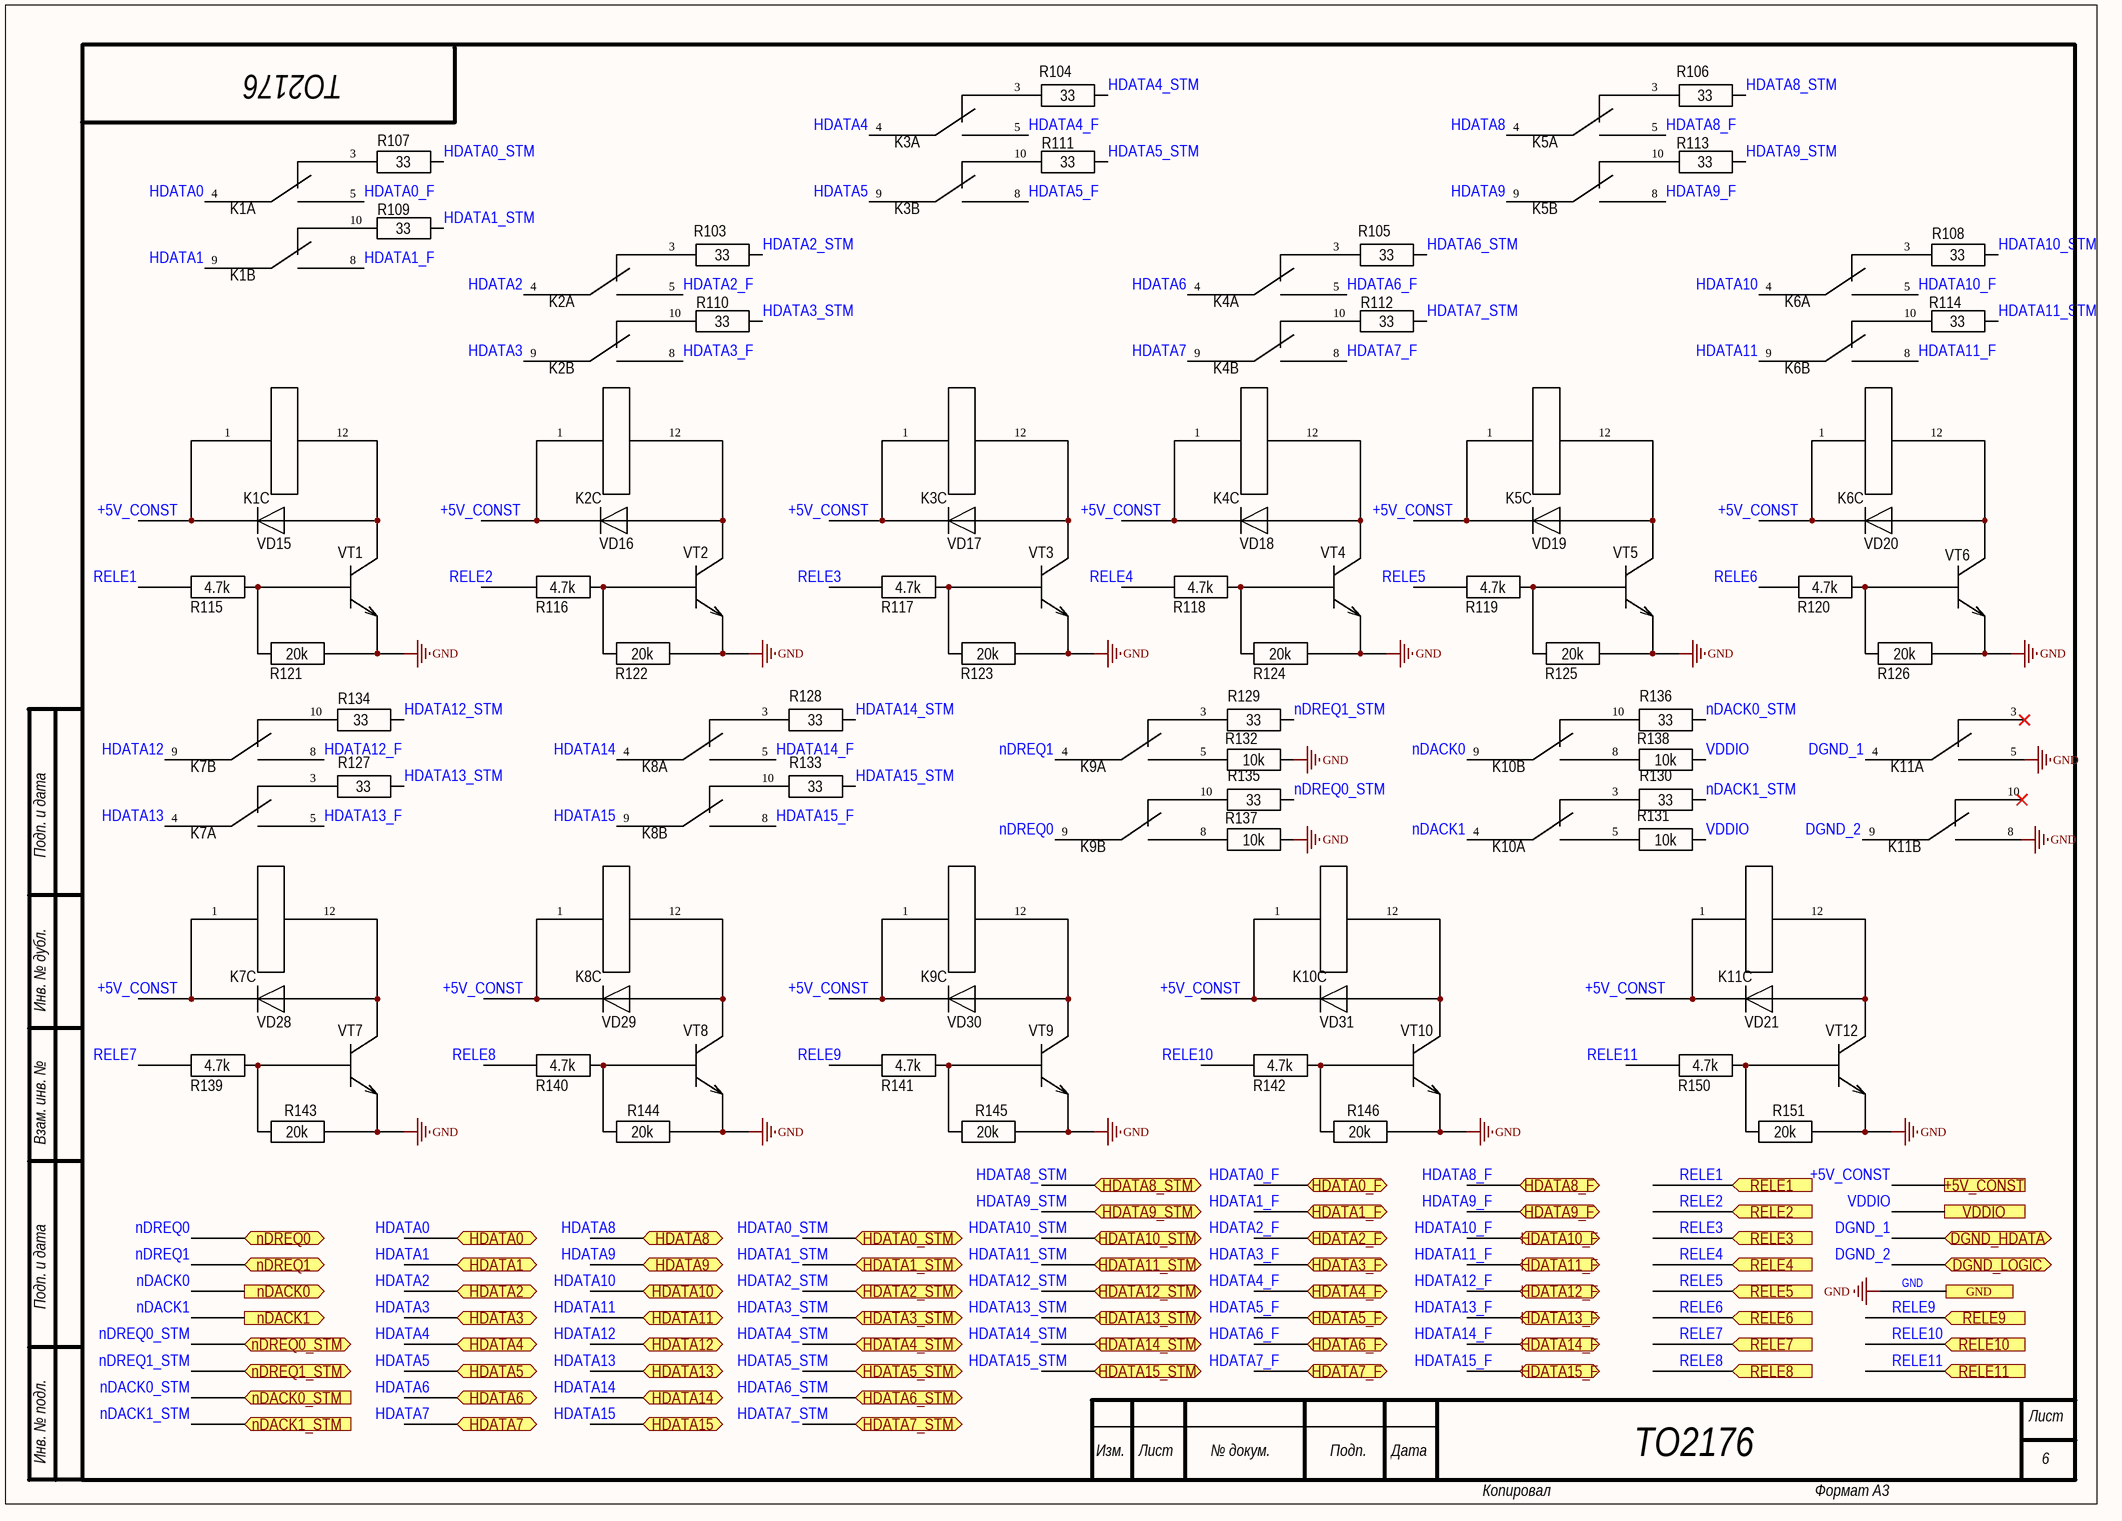
[diagram p6: RELE.SchDoc]

### Parts
K1  V23079A1001B301 TE  [V23079A1001B301]  (value not drawn)  (parts A,B,C of 3)
K2  V23079A1001B301 TE  [V23079A1001B301]  (value not drawn)  (parts A,B,C of 3)
K3  V23079A1001B301 TE  [V23079A1001B301]  (value not drawn)  (parts A,B,C of 3)
K4  V23079A1001B301 TE  [V23079A1001B301]  (value not drawn)  (parts A,B,C of 3)
K5  V23079A1001B301 TE  [V23079A1001B301]  (value not drawn)  (parts A,B,C of 3)
K6  V23079A1001B301 TE  [V23079A1001B301]  (value not drawn)  (parts A,B,C of 3)
K7  V23079A1001B301 TE  [V23079A1001B301]  (value not drawn)  (parts A,B,C of 3)
K8  V23079A1001B301 TE  [V23079A1001B301]  (value not drawn)  (parts A,B,C of 3)
K9  V23079A1001B301 TE  [V23079A1001B301]  (value not drawn)  (parts A,B,C of 3)
K10  V23079A1001B301 TE  [V23079A1001B301]  (value not drawn)  (parts A,B,C of 3)
K11  V23079A1001B301 TE  [V23079A1001B301]  (value not drawn)  (parts A,B,C of 3)
R103  33  [0603]
R104  33  [0603]
R105  33  [0603]
R106  33  [0603]
R107  33  [0603]
R108  33  [0603]
R109  33  [0603]
R110  33  [0603]
R111  33  [0603]
R112  33  [0603]
R113  33  [0603]
R114  33  [0603]
R115  4.7k  [0805]
R116  4.7k  [0805]
R117  4.7k  [0805]
R118  4.7k  [0805]
R119  4.7k  [0805]
R120  4.7k  [0805]
R121  20k  [0805]
R122  20k  [0805]
R123  20k  [0805]
R124  20k  [0805]
R125  20k  [0805]
R126  20k  [0805]
R127  33  [0603]
R128  33  [0603]
R129  33  [0603]
R130  33  [0603]
R131  10k  [0603]
R132  10k  [0603]
R133  33  [0603]
R134  33  [0603]
R135  33  [0603]
R136  33  [0603]
R137  10k  [0603]
R138  10k  [0603]
R139  4.7k  [0805]
R140  4.7k  [0805]
R141  4.7k  [0805]
R142  4.7k  [0805]
R143  20k  [0805]
R144  20k  [0805]
R145  20k  [0805]
R146  20k  [0805]
R150  4.7k  [0805]
R151  20k  [0805]
VD15  LL4148 NXP  [SOD80C]  (value not drawn)
VD16  LL4148 NXP  [SOD80C]  (value not drawn)
VD17  LL4148 NXP  [SOD80C]  (value not drawn)
VD18  LL4148 NXP  [SOD80C]  (value not drawn)
VD19  LL4148 NXP  [SOD80C]  (value not drawn)
VD20  LL4148 NXP  [SOD80C]  (value not drawn)
VD21  LL4148 NXP  [SOD80C]  (value not drawn)
VD28  LL4148 NXP  [SOD80C]  (value not drawn)
VD29  LL4148 NXP  [SOD80C]  (value not drawn)
VD30  LL4148 NXP  [SOD80C]  (value not drawn)
VD31  LL4148 NXP  [SOD80C]  (value not drawn)
VT1  MMBT5551L  [SOT-23]  (value not drawn)
VT2  MMBT5551L  [SOT-23]  (value not drawn)
VT3  MMBT5551L  [SOT-23]  (value not drawn)
VT4  MMBT5551L  [SOT-23]  (value not drawn)
VT5  MMBT5551L  [SOT-23]  (value not drawn)
VT6  MMBT5551L  [SOT-23]  (value not drawn)
VT7  MMBT5551L  [SOT-23]  (value not drawn)
VT8  MMBT5551L  [SOT-23]  (value not drawn)
VT9  MMBT5551L  [SOT-23]  (value not drawn)
VT10  MMBT5551L  [SOT-23]  (value not drawn)
VT12  MMBT5551L  [SOT-23]  (value not drawn)

### Ports
+5V_CONST, DGND_HDATA (bidir), DGND_LOGIC (bidir), GND, HDATA0 (bidir), HDATA0_F (bidir), HDATA0_STM (bidir), HDATA1 (bidir), HDATA1_F (bidir), HDATA1_STM (bidir), HDATA2 (bidir), HDATA2_F (bidir), HDATA2_STM (bidir), HDATA3 (bidir), HDATA3_F (bidir), HDATA3_STM (bidir), HDATA4 (bidir), HDATA4_F (bidir), HDATA4_STM (bidir), HDATA5 (bidir), HDATA5_F (bidir), HDATA5_STM (bidir), HDATA6 (bidir), HDATA6_F (bidir), HDATA6_STM (bidir), HDATA7 (bidir), HDATA7_F (bidir), HDATA7_STM (bidir), HDATA8 (bidir), HDATA8_F (bidir), HDATA8_STM (bidir), HDATA9 (bidir), HDATA9_F (bidir), HDATA9_STM (bidir), HDATA10 (bidir), HDATA10_F (bidir), HDATA10_STM (bidir), HDATA11 (bidir), HDATA11_F (bidir), HDATA11_STM (bidir), HDATA12 (bidir), HDATA12_F (bidir), HDATA12_STM (bidir), HDATA13 (bidir), HDATA13_F (bidir), HDATA13_STM (bidir), HDATA14 (bidir), HDATA14_F (bidir), HDATA14_STM (bidir), HDATA15 (bidir), HDATA15_F (bidir), HDATA15_STM (bidir), nDACK0 (out), nDACK0_STM (in), nDACK1 (out), nDACK1_STM (in), nDREQ0 (bidir), nDREQ0_STM (bidir), nDREQ1 (bidir), nDREQ1_STM (bidir), RELE1 (in), RELE2 (in), RELE3 (in), RELE4 (in), RELE5 (in), RELE6 (in), RELE7 (in), RELE8 (in), RELE9 (in), RELE10 (in), RELE11 (in), VDDIO

### Nets
GND: K11.5 K11.8 R121.1 R122.1 R123.1 R124.1 R125.1 R126.1 R132.2 R137.2 R143.1 R144.1 R145.1 R146.1 R151.1 VT1.2(E) VT2.2(E) VT3.2(E) VT4.2(E) VT5.2(E) VT6.2(E) VT7.2(E) VT8.2(E) VT9.2(E) VT10.2(E) VT12.2(E) ; port GND
VDDIO: R131.2 R138.2 ; port VDDIO  [project net +3.3V]
+5V_CONST: K1.1 K2.1 K3.1 K4.1 K5.1 K6.1 K7.1 K8.1 K9.1 K10.1 K11.1 VD15.2(K) VD16.2(K) VD17.2(K) VD18.2(K) VD19.2(K) VD20.2(K) VD21.2(K) VD28.2(K) VD29.2(K) VD30.2(K) VD31.2(K) ; port +5V_CONST  [project net +5V]
DGND_1: K11.4 ; port DGND_HDATA
DGND_2: K11.9 ; port DGND_LOGIC
HDATA0: K1.4 ; port HDATA0
HDATA0_F: K1.5 ; port HDATA0_F
HDATA0_STM: R107.2 ; port HDATA0_STM  [project net FMC_D0]
HDATA1: K1.9 ; port HDATA1
HDATA1_F: K1.8 ; port HDATA1_F
HDATA1_STM: R109.2 ; port HDATA1_STM  [project net FMC_D1]
HDATA2: K2.4 ; port HDATA2
HDATA2_F: K2.5 ; port HDATA2_F
HDATA2_STM: R103.2 ; port HDATA2_STM  [project net FMC_D2]
HDATA3: K2.9 ; port HDATA3
HDATA3_F: K2.8 ; port HDATA3_F
HDATA3_STM: R110.2 ; port HDATA3_STM  [project net FMC_D3]
HDATA4: K3.4 ; port HDATA4
HDATA4_F: K3.5 ; port HDATA4_F
HDATA4_STM: R104.2 ; port HDATA4_STM  [project net FMC_D4]
HDATA5: K3.9 ; port HDATA5
HDATA5_F: K3.8 ; port HDATA5_F
HDATA5_STM: R111.2 ; port HDATA5_STM  [project net FMC_D5]
HDATA6: K4.4 ; port HDATA6
HDATA6_F: K4.5 ; port HDATA6_F
HDATA6_STM: R105.2 ; port HDATA6_STM  [project net FMC_D6]
HDATA7: K4.9 ; port HDATA7
HDATA7_F: K4.8 ; port HDATA7_F
HDATA7_STM: R112.2 ; port HDATA7_STM  [project net FMC_D7]
HDATA8: K5.4 ; port HDATA8
HDATA8_F: K5.5 ; port HDATA8_F
HDATA8_STM: R106.2 ; port HDATA8_STM  [project net FMC_D8]
HDATA9: K5.9 ; port HDATA9
HDATA9_F: K5.8 ; port HDATA9_F
HDATA9_STM: R113.2 ; port HDATA9_STM  [project net FMC_D9]
HDATA10: K6.4 ; port HDATA10
HDATA10_F: K6.5 ; port HDATA10_F
HDATA10_STM: R108.2 ; port HDATA10_STM  [project net FMC_D10]
HDATA11: K6.9 ; port HDATA11
HDATA11_F: K6.8 ; port HDATA11_F
HDATA11_STM: R114.2 ; port HDATA11_STM  [project net FMC_D11]
HDATA12: K7.9 ; port HDATA12
HDATA12_F: K7.8 ; port HDATA12_F
HDATA12_STM: R134.2 ; port HDATA12_STM  [project net FMC_D12]
HDATA13: K7.4 ; port HDATA13
HDATA13_F: K7.5 ; port HDATA13_F
HDATA13_STM: R127.2 ; port HDATA13_STM  [project net FMC_D13]
HDATA14: K8.4 ; port HDATA14
HDATA14_F: K8.5 ; port HDATA14_F
HDATA14_STM: R128.2 ; port HDATA14_STM  [project net FMC_D14]
HDATA15: K8.9 ; port HDATA15
HDATA15_F: K8.8 ; port HDATA15_F
HDATA15_STM: R133.2 ; port HDATA15_STM  [project net FMC_D15]
nDACK0: K10.9 ; port nDACK0
nDACK0_STM: R136.2 ; port nDACK0_STM
nDACK1: K10.4 ; port nDACK1
nDACK1_STM: R130.2 ; port nDACK1_STM
nDREQ0: K9.9 ; port nDREQ0
nDREQ0_STM: R135.2 ; port nDREQ0_STM
nDREQ1: K9.4 ; port nDREQ1
nDREQ1_STM: R129.2 ; port nDREQ1_STM
RELE1: R115.2 ; port RELE1
RELE2: R116.2 ; port RELE2
RELE3: R117.2 ; port RELE3
RELE4: R118.2 ; port RELE4
RELE5: R119.2 ; port RELE5
RELE6: R120.2 ; port RELE6
RELE7: R139.2 ; port RELE7
RELE8: R140.2 ; port RELE8
RELE9: R141.2 ; port RELE9
RELE10: R142.2 ; port RELE10
RELE11: R150.2 ; port RELE11
NetK1_3: K1.3 R107.1
NetK1_10: K1.10 R109.1
NetK1_12: K1.12 VD15.1(A) VT1.3(K)
NetK2_3: K2.3 R103.1
NetK2_10: K2.10 R110.1
NetK2_12: K2.12 VD16.1(A) VT2.3(K)
NetK3_3: K3.3 R104.1
NetK3_10: K3.10 R111.1
NetK3_12: K3.12 VD17.1(A) VT3.3(K)
NetK4_3: K4.3 R105.1
NetK4_10: K4.10 R112.1
NetK4_12: K4.12 VD18.1(A) VT4.3(K)
NetK5_3: K5.3 R106.1
NetK5_10: K5.10 R113.1
NetK5_12: K5.12 VD19.1(A) VT5.3(K)
NetK6_3: K6.3 R108.1
NetK6_10: K6.10 R114.1
NetK6_12: K6.12 VD20.1(A) VT6.3(K)
NetK7_3: K7.3 R127.1
NetK7_10: K7.10 R134.1
NetK7_12: K7.12 VD28.1(A) VT7.3(K)
NetK8_3: K8.3 R128.1
NetK8_10: K8.10 R133.1
NetK8_12: K8.12 VD29.1(A) VT8.3(K)
NetK9_3: K9.3 R129.1
NetK9_5: K9.5 R132.1
NetK9_8: K9.8 R137.1
NetK9_10: K9.10 R135.1
NetK9_12: K9.12 VD30.1(A) VT9.3(K)
NetK10_3: K10.3 R130.1
NetK10_5: K10.5 R131.1
NetK10_8: K10.8 R138.1
NetK10_10: K10.10 R136.1
NetK10_12: K10.12 VD31.1(A) VT10.3(K)
NetK11_12: K11.12 VD21.1(A) VT12.3(K)
NetR115_1: R115.1 R121.2 VT1.1(B)
NetR116_1: R116.1 R122.2 VT2.1(B)
NetR117_1: R117.1 R123.2 VT3.1(B)
NetR118_1: R118.1 R124.2 VT4.1(B)
NetR119_1: R119.1 R125.2 VT5.1(B)
NetR120_1: R120.1 R126.2 VT6.1(B)
NetR139_1: R139.1 R143.2 VT7.1(B)
NetR140_1: R140.1 R144.2 VT8.1(B)
NetR141_1: R141.1 R145.2 VT9.1(B)
NetR142_1: R142.1 R146.2 VT10.1(B)
NetR150_1: R150.1 R151.2 VT12.1(B)

Not connected (* = marked no-connect by the designer): K11 3* 10*

### Notes on the sheet
- ТО2176
- Подп. и дата
- Инв. № дубл.
- Взам. инв. №
- Инв. № подл.
- Изм.
- Лист
- № докум.
- Подп.
- Дата
- 6
- Копировал
- Формат А3

### Library data of the parts
R103-R114 R127-R138 = R0603 Yageo: as R49 on sheet Main; Packaging: 0402; ClassName: *; Component Link: *; NN: *
R115-R126 R139-R146 R150 R151 = R0805 Yageo: as R90 on sheet ADV7180; ClassName: *; ComponentWeigt: *; Component Link: *; Packaging: 0805; NN: *; Value: *
VD15-VD21 VD28-VD31 = LL4148 NXP: ComponentHeigt: 1.6; Leadform: SMD; NN: 24009301; KIND: Диод LL4148 NXP; Component Link: http://www.nxp.com; Packaging: SOD-80C; ClassName: *; Firme: NXP
VT1-VT10 VT12 = MMBT5551L: ComponentHeigt: 1.1; Firme: ONS; Leadform: SMD; NN: 24007468; KIND: Транзистор MMBT5551L*G ONS; ClassName: *; ComponentWeigt: *; Packaging: SOT-23